# Altium project SBC_Project.PrjPcb (part 2 of 3)

## Sheet 06_DRAM.SchDoc
size A3; SheetNumber: 9; SheetTotal: 21
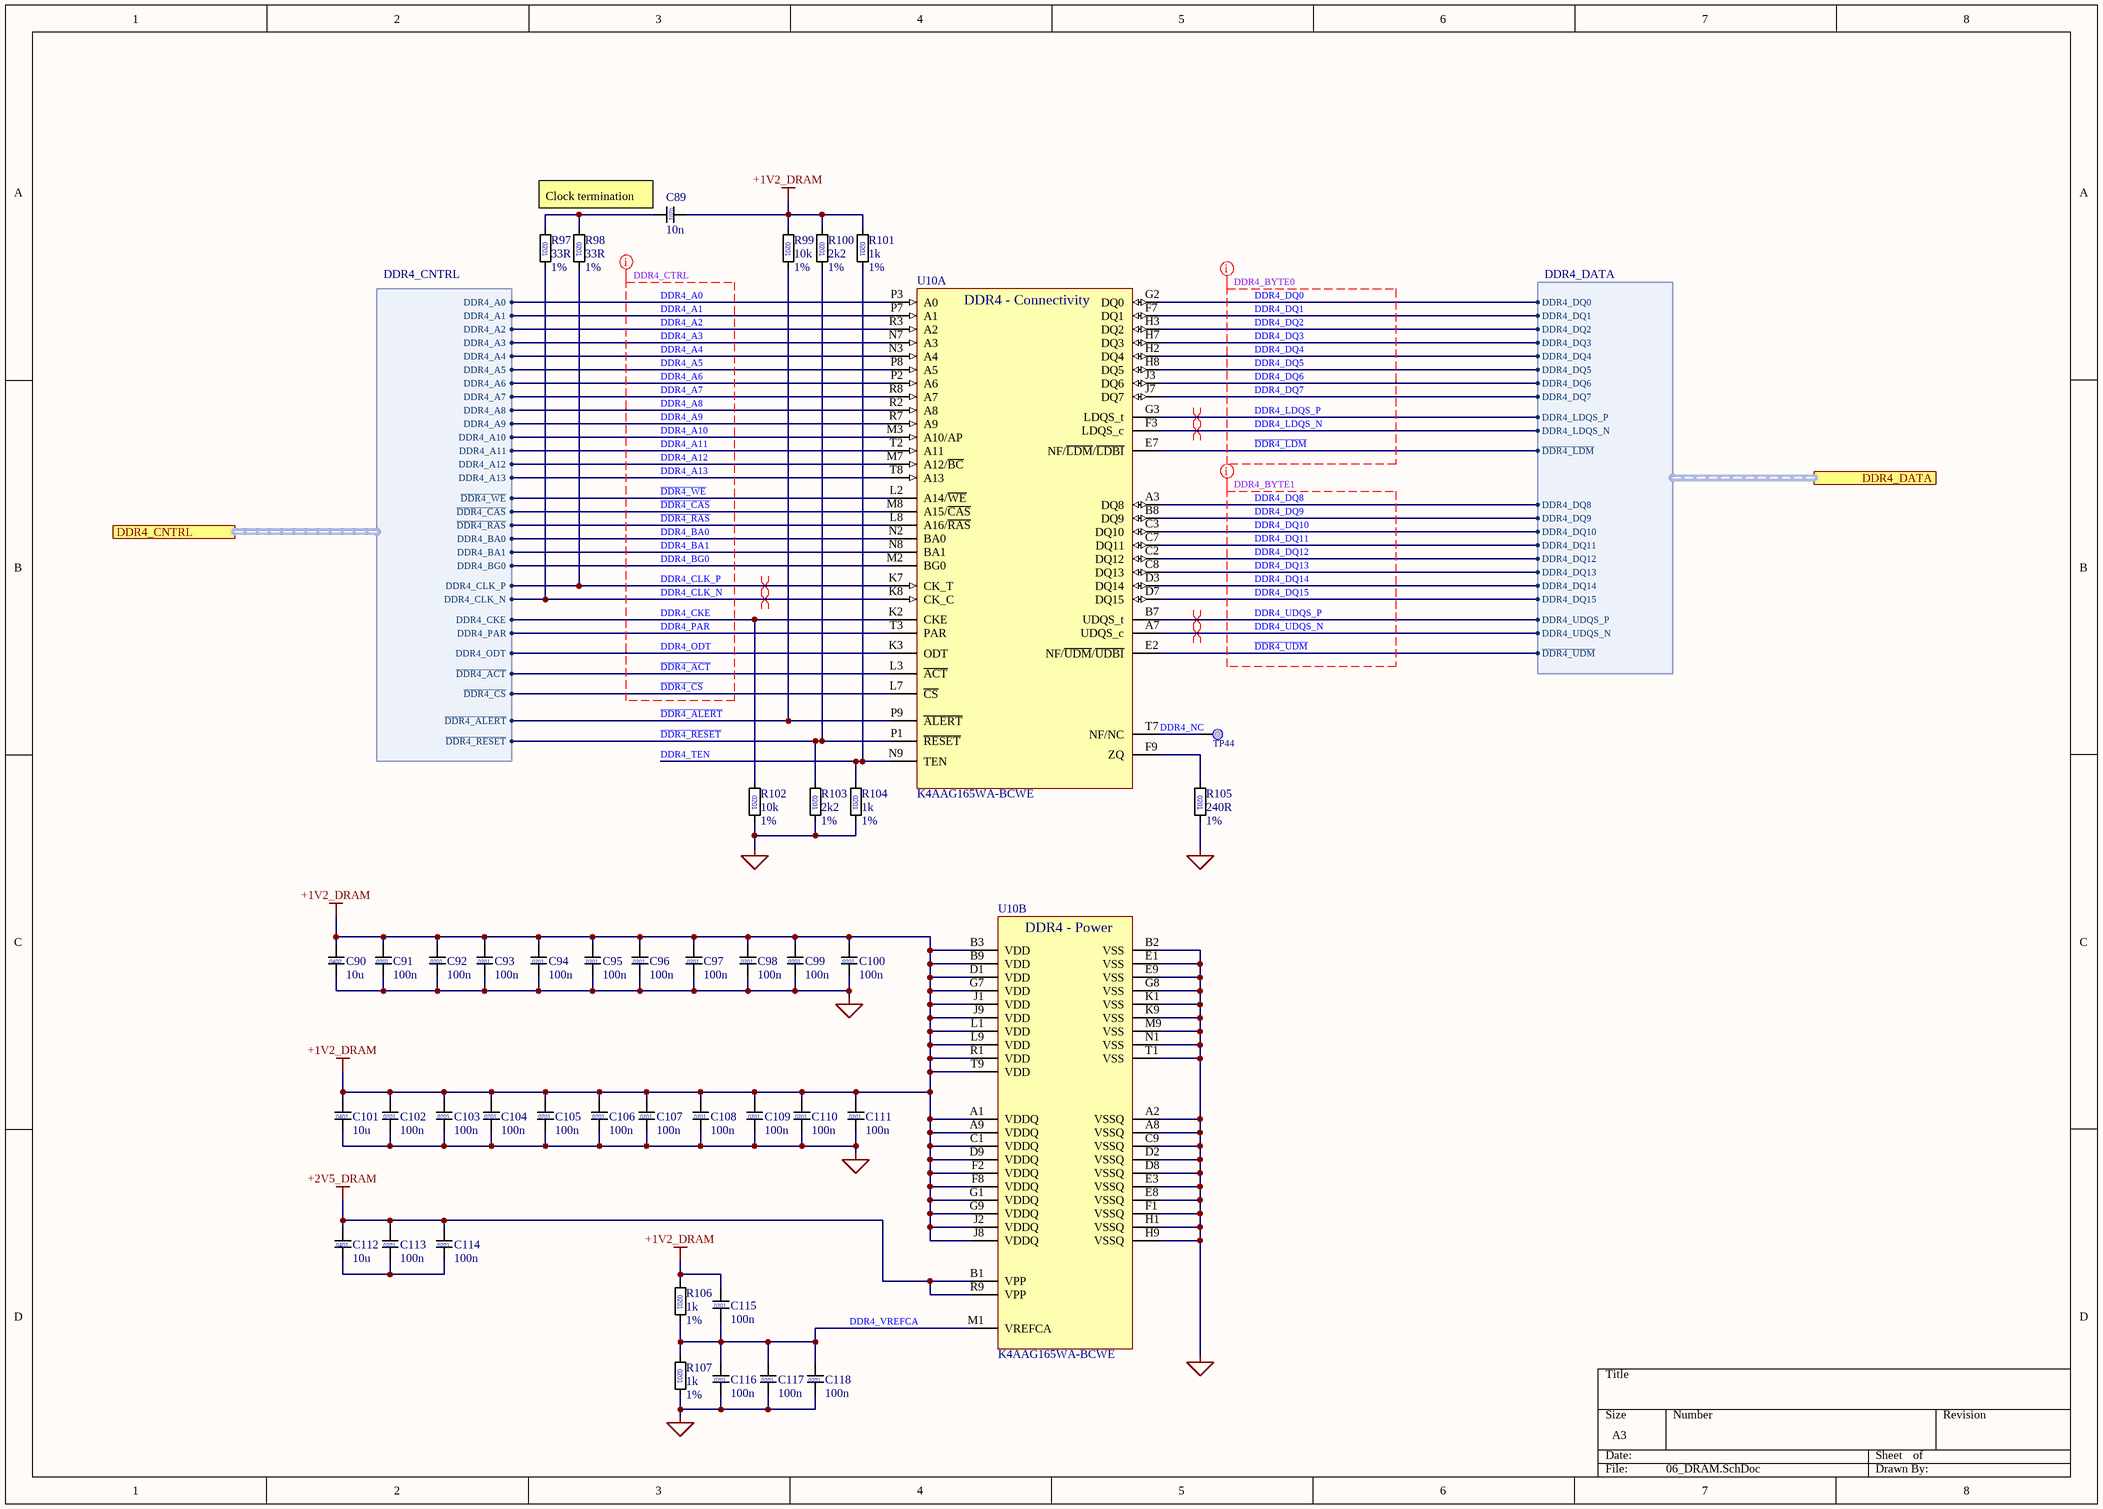
[diagram p8: 06_DRAM.SchDoc]

### Parts
C89  value 10n  [C0201]  (hidden comment: C_0201)
C90  value 10u  [C0402]  (hidden comment: 4u7)
C91  value 100n  [C0201]  (hidden comment: C_0201)
C92  value 100n  [C0201]  (hidden comment: C_0201)
C93  value 100n  [C0201]  (hidden comment: C_0201)
C94  value 100n  [C0201]  (hidden comment: C_0201)
C95  value 100n  [C0201]  (hidden comment: C_0201)
C96  value 100n  [C0201]  (hidden comment: C_0201)
C97  value 100n  [C0201]  (hidden comment: C_0201)
C98  value 100n  [C0201]  (hidden comment: C_0201)
C99  value 100n  [C0201]  (hidden comment: C_0201)
C100  value 100n  [C0201]  (hidden comment: C_0201)
C101  value 10u  [C0402]  (hidden comment: 4u7)
C102  value 100n  [C0201]  (hidden comment: C_0201)
C103  value 100n  [C0201]  (hidden comment: C_0201)
C104  value 100n  [C0201]  (hidden comment: C_0201)
C105  value 100n  [C0201]  (hidden comment: C_0201)
C106  value 100n  [C0201]  (hidden comment: C_0201)
C107  value 100n  [C0201]  (hidden comment: C_0201)
C108  value 100n  [C0201]  (hidden comment: C_0201)
C109  value 100n  [C0201]  (hidden comment: C_0201)
C110  value 100n  [C0201]  (hidden comment: C_0201)
C111  value 100n  [C0201]  (hidden comment: C_0201)
C112  value 10u  [C0402]  (hidden comment: 4u7)
C113  value 100n  [C0201]  (hidden comment: C_0201)
C114  value 100n  [C0201]  (hidden comment: C_0201)
C115  value 100n  [C0201]  (hidden comment: C_0201)
C116  value 100n  [C0201]  (hidden comment: C_0201)
C117  value 100n  [C0201]  (hidden comment: C_0201)
C118  value 100n  [C0201]  (hidden comment: C_0201)
R97  value 33R  Tolerance: 1%  [R0201]  (hidden comment: 0201)
R98  value 33R  Tolerance: 1%  [R0201]  (hidden comment: 0201)
R99  value 10k  Tolerance: 1%  [R0201]  (hidden comment: 0201)
R100  value 2k2  Tolerance: 1%  [R0201]  (hidden comment: 0201)
R101  value 1k  Tolerance: 1%  [R0201]  (hidden comment: 0201)
R102  value 10k  Tolerance: 1%  [R0201]  (hidden comment: 0201)
R103  value 2k2  Tolerance: 1%  [R0201]  (hidden comment: 0201)
R104  value 1k  Tolerance: 1%  [R0201]  (hidden comment: 0201)
R105  value 240R  Tolerance: 1%  [R0201]  (hidden comment: 0201)
R106  value 1k  Tolerance: 1%  [R0201]  (hidden comment: 0201)
R107  value 1k  Tolerance: 1%  [R0201]  (hidden comment: 0201)
TP44  Testpoint 0.5mm  [TP_0.50mm]  (value not drawn)  (no BOM)
U10  K4AAG165WA-BCWE  [FBGA-96_8x14mm_Layout9x16_P0.8mm]  (parts A,B of 2)

### Ports
DDR4_CNTRL (harness DDR4_CNTRL, see 01_SBC_SCH[3A], 02_SoC_DRAM_DDR4[1B]), DDR4_DATA (harness DDR4_DATA, see 01_SBC_SCH[3A], 02_SoC_DRAM_DDR4[7B])

### Harnesses
DDR4_CNTRL: DDR4_A0, DDR4_A1, DDR4_A2, DDR4_A3, DDR4_A4, DDR4_A5, DDR4_A6, DDR4_A7, DDR4_A8, DDR4_A9, DDR4_A10, DDR4_A11, DDR4_A12, DDR4_A13, ~{DDR4_WE}, ~{DDR4_CAS}, ~{DDR4_RAS}, DDR4_BA0, DDR4_BA1, DDR4_BG0, DDR4_CLK_P, DDR4_CLK_N, DDR4_CKE, DDR4_PAR, DDR4_ODT, ~{DDR4_ACT}, ~{DDR4_CS}, ~{DDR4_ALERT}, ~{DDR4_RESET}
DDR4_DATA: DDR4_DQ0, DDR4_DQ1, DDR4_DQ2, DDR4_DQ3, DDR4_DQ4, DDR4_DQ5, DDR4_DQ6, DDR4_DQ7, DDR4_LDQS_P, DDR4_LDQS_N, ~{DDR4_LDM}, DDR4_DQ8, DDR4_DQ9, DDR4_DQ10, DDR4_DQ11, DDR4_DQ12, DDR4_DQ13, DDR4_DQ14, DDR4_DQ15, DDR4_UDQS_P, DDR4_UDQS_N, ~{DDR4_UDM}

### Nets
+1V2_DRAM: C89.2 C90.1 C91.1 C92.1 C93.1 C94.1 C95.1 C96.1 C97.1 C98.1 C99.1 C100.1 C101.1 C102.1 C103.1 C104.1 C105.1 C106.1 C107.1 C108.1 C109.1 C110.1 C111.1 C115.1 R99.1 R100.1 R101.1 R106.1 U10.A1(VDDQ) U10.A9(VDDQ) U10.B3(VDD) U10.B9(VDD) U10.C1(VDDQ) U10.D1(VDD) U10.D9(VDDQ) U10.F2(VDDQ) U10.F8(VDDQ) U10.G1(VDDQ) U10.G7(VDD) U10.G9(VDDQ) U10.J1(VDD) U10.J2(VDDQ) U10.J8(VDDQ) U10.J9(VDD) U10.L1(VDD) U10.L9(VDD) U10.R1(VDD) U10.T9(VDD)
+2V5_DRAM: C112.1 C113.1 C114.1 U10.B1(VPP) U10.R9(VPP)
GND: C90.2 C91.2 C92.2 C93.2 C94.2 C95.2 C96.2 C97.2 C98.2 C99.2 C100.2 C101.2 C102.2 C103.2 C104.2 C105.2 C106.2 C107.2 C108.2 C109.2 C110.2 C111.2 C116.2 C117.2 C118.2 R102.2 R103.2 R104.2 R105.2 R107.2 U10.A2(VSSQ) U10.A8(VSSQ) U10.B2(VSS) U10.C9(VSSQ) U10.D2(VSSQ) U10.D8(VSSQ) U10.E1(VSS) U10.E3(VSSQ) U10.E8(VSSQ) U10.E9(VSS) U10.F1(VSSQ) U10.G8(VSS) U10.H1(VSSQ) U10.H9(VSSQ) U10.K1(VSS) U10.K9(VSS) U10.M9(VSS) U10.N1(VSS) U10.T1(VSS)
~{DDR4_ACT}: U10.L3(~{ACT}) ; port DDR4_CNTRL.~{DDR4_ACT}
~{DDR4_ALERT}: R99.2 U10.P9(~{ALERT}) ; port DDR4_CNTRL.~{DDR4_ALERT}
~{DDR4_CAS}: U10.M8(A15/~{CAS}) ; port DDR4_CNTRL.~{DDR4_CAS}
~{DDR4_CS}: U10.L7(~{CS}) ; port DDR4_CNTRL.~{DDR4_CS}
~{DDR4_LDM}: U10.E7(NF/~{LDM}/~{LDBI}) ; port DDR4_DATA.~{DDR4_LDM}
~{DDR4_RAS}: U10.L8(A16/~{RAS}) ; port DDR4_CNTRL.~{DDR4_RAS}
~{DDR4_RESET}: R100.2 R103.1 U10.P1(~{RESET}) ; port DDR4_CNTRL.~{DDR4_RESET}
~{DDR4_UDM}: U10.E2(NF/~{UDM}/~{UDBI}) ; port DDR4_DATA.~{DDR4_UDM}
~{DDR4_WE}: U10.L2(A14/~{WE}) ; port DDR4_CNTRL.~{DDR4_WE}
DDR4_A0: U10.P3(A0) ; port DDR4_CNTRL.DDR4_A0
DDR4_A1: U10.P7(A1) ; port DDR4_CNTRL.DDR4_A1
DDR4_A2: U10.R3(A2) ; port DDR4_CNTRL.DDR4_A2
DDR4_A3: U10.N7(A3) ; port DDR4_CNTRL.DDR4_A3
DDR4_A4: U10.N3(A4) ; port DDR4_CNTRL.DDR4_A4
DDR4_A5: U10.P8(A5) ; port DDR4_CNTRL.DDR4_A5
DDR4_A6: U10.P2(A6) ; port DDR4_CNTRL.DDR4_A6
DDR4_A7: U10.R8(A7) ; port DDR4_CNTRL.DDR4_A7
DDR4_A8: U10.R2(A8) ; port DDR4_CNTRL.DDR4_A8
DDR4_A9: U10.R7(A9) ; port DDR4_CNTRL.DDR4_A9
DDR4_A10: U10.M3(A10/AP) ; port DDR4_CNTRL.DDR4_A10
DDR4_A11: U10.T2(A11) ; port DDR4_CNTRL.DDR4_A11
DDR4_A12: U10.M7(A12/~{BC}) ; port DDR4_CNTRL.DDR4_A12
DDR4_A13: U10.T8(A13) ; port DDR4_CNTRL.DDR4_A13
DDR4_BA0: U10.N2(BA0) ; port DDR4_CNTRL.DDR4_BA0
DDR4_BA1: U10.N8(BA1) ; port DDR4_CNTRL.DDR4_BA1
DDR4_BG0: U10.M2(BG0) ; port DDR4_CNTRL.DDR4_BG0
DDR4_CKE: R102.1 U10.K2(CKE) ; port DDR4_CNTRL.DDR4_CKE
DDR4_CLK_N: R97.2 U10.K8(CK_C) ; port DDR4_CNTRL.DDR4_CLK_N
DDR4_CLK_P: R98.2 U10.K7(CK_T) ; port DDR4_CNTRL.DDR4_CLK_P
DDR4_DQ0: U10.G2(DQ0) ; port DDR4_DATA.DDR4_DQ0
DDR4_DQ1: U10.F7(DQ1) ; port DDR4_DATA.DDR4_DQ1
DDR4_DQ2: U10.H3(DQ2) ; port DDR4_DATA.DDR4_DQ2
DDR4_DQ3: U10.H7(DQ3) ; port DDR4_DATA.DDR4_DQ3
DDR4_DQ4: U10.H2(DQ4) ; port DDR4_DATA.DDR4_DQ4
DDR4_DQ5: U10.H8(DQ5) ; port DDR4_DATA.DDR4_DQ5
DDR4_DQ6: U10.J3(DQ6) ; port DDR4_DATA.DDR4_DQ6
DDR4_DQ7: U10.J7(DQ7) ; port DDR4_DATA.DDR4_DQ7
DDR4_DQ8: U10.A3(DQ8) ; port DDR4_DATA.DDR4_DQ8
DDR4_DQ9: U10.B8(DQ9) ; port DDR4_DATA.DDR4_DQ9
DDR4_DQ10: U10.C3(DQ10) ; port DDR4_DATA.DDR4_DQ10
DDR4_DQ11: U10.C7(DQ11) ; port DDR4_DATA.DDR4_DQ11
DDR4_DQ12: U10.C2(DQ12) ; port DDR4_DATA.DDR4_DQ12
DDR4_DQ13: U10.C8(DQ13) ; port DDR4_DATA.DDR4_DQ13
DDR4_DQ14: U10.D3(DQ14) ; port DDR4_DATA.DDR4_DQ14
DDR4_DQ15: U10.D7(DQ15) ; port DDR4_DATA.DDR4_DQ15
DDR4_LDQS_N: U10.F3(LDQS_c) ; port DDR4_DATA.DDR4_LDQS_N
DDR4_LDQS_P: U10.G3(LDQS_t) ; port DDR4_DATA.DDR4_LDQS_P
DDR4_NC: TP44.TP U10.T7(NF/NC)
DDR4_ODT: U10.K3(ODT) ; port DDR4_CNTRL.DDR4_ODT
DDR4_PAR: U10.T3(PAR) ; port DDR4_CNTRL.DDR4_PAR
DDR4_TEN: R101.2 R104.1 U10.N9(TEN)
DDR4_UDQS_N: U10.A7(UDQS_c) ; port DDR4_DATA.DDR4_UDQS_N
DDR4_UDQS_P: U10.B7(UDQS_t) ; port DDR4_DATA.DDR4_UDQS_P
DDR4_VREFCA: C115.2 C116.1 C117.1 C118.1 R106.2 R107.1 U10.M1(VREFCA)
NetC89_1: C89.1 R97.1 R98.1
NetC112_2: C112.2 C113.2 C114.2
NetR105_1: R105.1 U10.F9(ZQ)

### Layout directives
net class DDR4_BYTE0; rule Length Constraint [Min Delay = 0ps    Max Delay = 500ps]; rule Matched Net Lengths [Delay Tolerance = 0.4ps]; rule Matched Net Lengths [Delay Tolerance = 2ps]; net class SE45: DDR4_DQ0, DDR4_DQ1, DDR4_DQ2, DDR4_DQ3, DDR4_DQ4, DDR4_DQ5, DDR4_DQ6, DDR4_DQ7, DDR4_LDQS_N, DDR4_LDQS_P, ~{DDR4_LDM}
net class DDR4_BYTE1; rule Length Constraint [Min Delay = 0ps    Max Delay = 500ps]; rule Matched Net Lengths [Delay Tolerance = 0.4ps]; rule Matched Net Lengths [Delay Tolerance = 2ps]; net class SE45: DDR4_DQ8, DDR4_DQ9, DDR4_DQ10, DDR4_DQ11, DDR4_DQ12, DDR4_DQ13, DDR4_DQ14, DDR4_DQ15, DDR4_UDQS_N, DDR4_UDQS_P, ~{DDR4_UDM}
differential pair; differential pair class DIFF85: DDR4_CLK_N, DDR4_CLK_P, DDR4_LDQS_N, DDR4_LDQS_P, DDR4_UDQS_N, DDR4_UDQS_P
net class DDR4_CTRL; rule Matched Net Lengths [Delay Tolerance = 3ps]; rule Length Constraint [Min Delay = 0ps    Max Delay = 500ps]; net class SE45; rule Matched Net Lengths [Delay Tolerance = 0.4ps]: DDR4_A0, DDR4_A1, DDR4_A2, DDR4_A3, DDR4_A4, DDR4_A5, DDR4_A6, DDR4_A7, DDR4_A8, DDR4_A9, DDR4_A10, DDR4_A11, DDR4_A12, DDR4_A13, DDR4_BA0, DDR4_BA1, DDR4_BG0, DDR4_CKE, DDR4_CLK_N, DDR4_CLK_P, DDR4_ODT, DDR4_PAR, ~{DDR4_ACT}, ~{DDR4_CAS}, ~{DDR4_CS}, ~{DDR4_RAS}, ~{DDR4_WE}

### Notes on the sheet
- (near C89) Clock termination
- (in symbol C_0201) 0201
- (in symbol C_0402) 0402
- (in symbol K4AAG165WA-BCWE, part A) DDR4 - Connectivity
- (in symbol K4AAG165WA-BCWE, part B) DDR4 - Power

### Library data of the parts
C89 C91-C100 C102-C111 C113-C118 = C_0201: MLCC 0201; Manufacturer_Name: *; Manufacturer_Part_Number: *
C90 C101 C112 = C_0402: MLCC 0402; Manufacturer_Name: *; Manufacturer_Part_Number: *
R97-R107 = R_0201: Manufacturer_Name: *; Manufacturer_Part_Number: *
U10 = K4AAG165WA-BCWE: 1G x 16-bit (16 Gbit) CMOS Double Data Rate IV Synchronous RAM, FBGA-96; KiCad_Footprint: Package_BGA:Samsung_FBGA-96_8x14mm_Layout9x16_P0.8mm; Datasheet: https://www.alldatasheet.com/datasheet-pdf/pdf/1643784/SAMSUNG/K4AAG165WA-BCWE.html; ComponentLink1Description: Datasheet; ComponentLink1URL: https://www.alldatasheet.com/datasheet-pdf/pdf/1643784/SAMSUNG/K4AAG165WA-BCWE.html; Manufacturer_Name: *; Manufacturer_Part_Number: *

## Sheet 13_eMMC_Flash.SchDoc
size A3; SheetNumber: 10; SheetTotal: 21
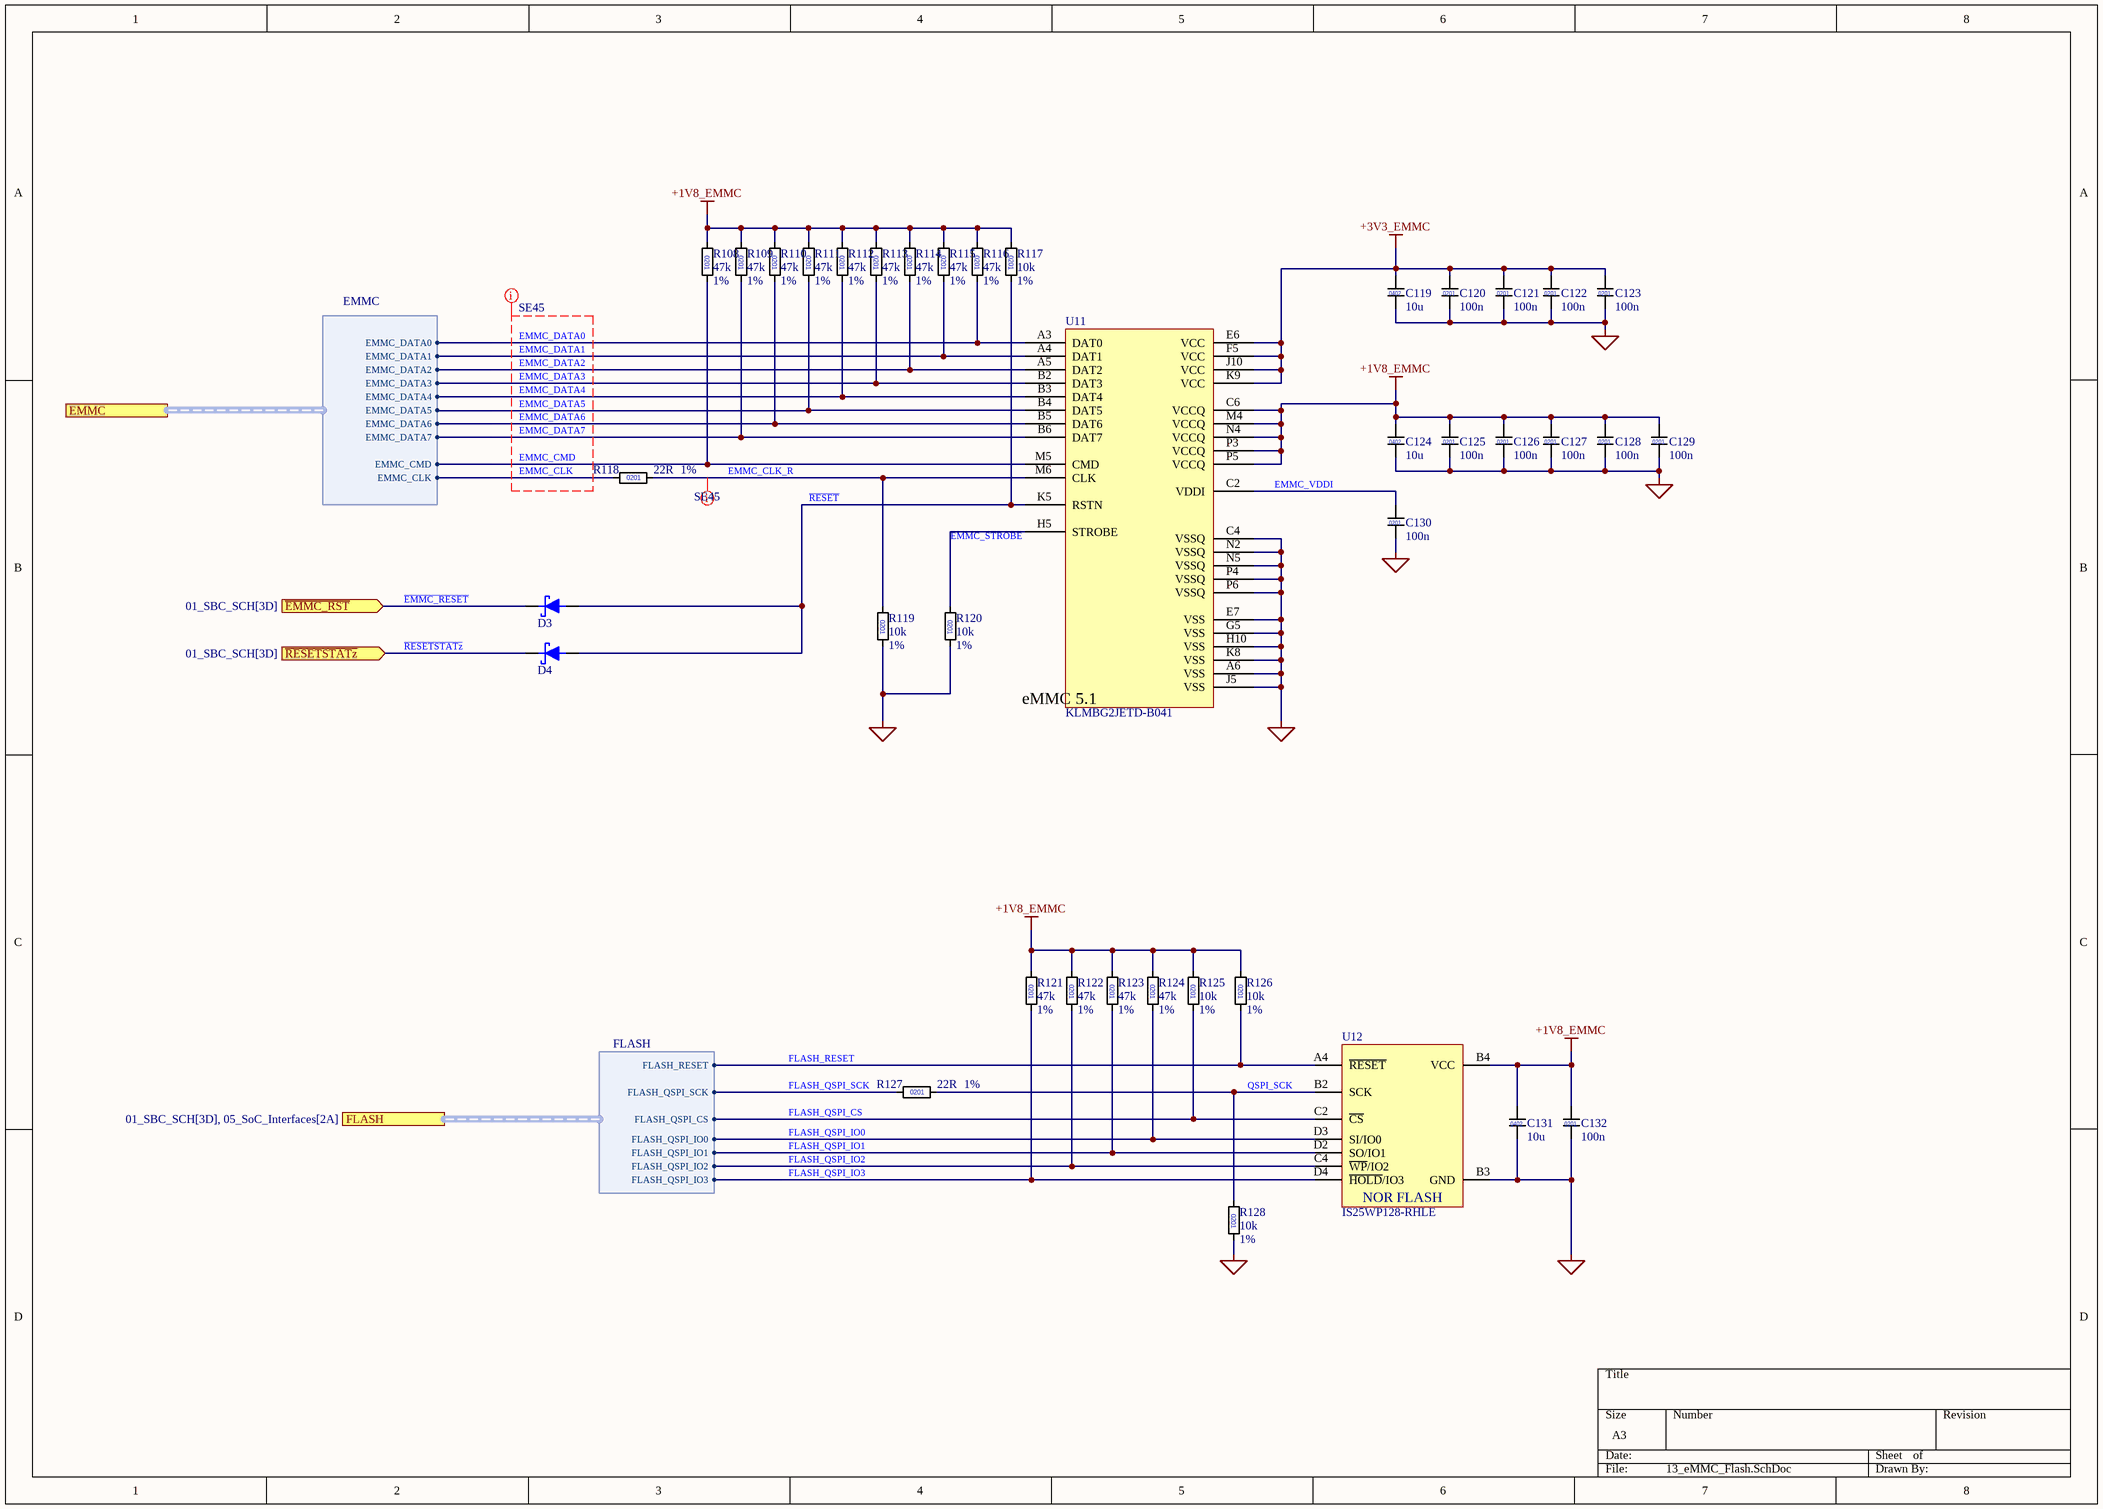
[diagram p9: 13_eMMC_Flash.SchDoc]

### Parts
C119  value 10u  [C0402]  (hidden comment: 4u7)
C120  value 100n  [C0201]  (hidden comment: C_0201)
C121  value 100n  [C0201]  (hidden comment: C_0201)
C122  value 100n  [C0201]  (hidden comment: C_0201)
C123  value 100n  [C0201]  (hidden comment: C_0201)
C124  value 10u  [C0402]  (hidden comment: 4u7)
C125  value 100n  [C0201]  (hidden comment: C_0201)
C126  value 100n  [C0201]  (hidden comment: C_0201)
C127  value 100n  [C0201]  (hidden comment: C_0201)
C128  value 100n  [C0201]  (hidden comment: C_0201)
C129  value 100n  [C0201]  (hidden comment: C_0201)
C130  value 100n  [C0201]  (hidden comment: C_0201)
C131  value 10u  [C0402]  (hidden comment: 4u7)
C132  value 100n  [C0201]  (hidden comment: C_0201)
D3  D_Filled  [D_SOD-523]  (value not drawn)
D4  D_Filled  [D_SOD-523]  (value not drawn)
R108  value 47k  Tolerance: 1%  [R0201]  (hidden comment: 0201)
R109  value 47k  Tolerance: 1%  [R0201]  (hidden comment: 0201)
R110  value 47k  Tolerance: 1%  [R0201]  (hidden comment: 0201)
R111  value 47k  Tolerance: 1%  [R0201]  (hidden comment: 0201)
R112  value 47k  Tolerance: 1%  [R0201]  (hidden comment: 0201)
R113  value 47k  Tolerance: 1%  [R0201]  (hidden comment: 0201)
R114  value 47k  Tolerance: 1%  [R0201]  (hidden comment: 0201)
R115  value 47k  Tolerance: 1%  [R0201]  (hidden comment: 0201)
R116  value 47k  Tolerance: 1%  [R0201]  (hidden comment: 0201)
R117  value 10k  Tolerance: 1%  [R0201]  (hidden comment: 0201)
R118  value 22R  Tolerance: 1%  [R0201]  (hidden comment: 0201)
R119  value 10k  Tolerance: 1%  [R0201]  (hidden comment: 0201)
R120  value 10k  Tolerance: 1%  [R0201]  (hidden comment: 0201)
R121  value 47k  Tolerance: 1%  [R0201]  (hidden comment: 0201)
R122  value 47k  Tolerance: 1%  [R0201]  (hidden comment: 0201)
R123  value 47k  Tolerance: 1%  [R0201]  (hidden comment: 0201)
R124  value 47k  Tolerance: 1%  [R0201]  (hidden comment: 0201)
R125  value 10k  Tolerance: 1%  [R0201]  (hidden comment: 0201)
R126  value 10k  Tolerance: 1%  [R0201]  (hidden comment: 0201)
R127  value 22R  Tolerance: 1%  [R0201]  (hidden comment: 0201)
R128  value 10k  Tolerance: 1%  [R0201]  (hidden comment: 0201)
U11  KLMBG2JETD-B041  [LFBGA-153_11.5x13mm_Layout14x14_P0.5mm]
U12  IS25WP128-RHLE  [IS25WP128-RHLE]

### Ports
EMMC (harness EMMC, see 01_SBC_SCH[3C], 05_SoC_Interfaces[7A]), FLASH (harness FLASH, see 01_SBC_SCH[3D], 05_SoC_Interfaces[2A]), ~{EMMC_RST} (in, see 01_SBC_SCH[3D]), ~{RESETSTATz} (in, see 01_SBC_SCH[3D])

### Harnesses
EMMC: EMMC_DATA0, EMMC_DATA1, EMMC_DATA2, EMMC_DATA3, EMMC_DATA4, EMMC_DATA5, EMMC_DATA6, EMMC_DATA7, EMMC_CMD, EMMC_CLK
FLASH: FLASH_QSPI_SCK, FLASH_QSPI_CS, FLASH_QSPI_IO0, FLASH_QSPI_IO1, FLASH_QSPI_IO2, FLASH_QSPI_IO3, FLASH_RESET

### Nets
+1V8_EMMC: C124.1 C125.1 C126.1 C127.1 C128.1 C129.1 C131.1 C132.1 R108.1 R109.1 R110.1 R111.1 R112.1 R113.1 R114.1 R115.1 R116.1 R117.1 R121.1 R122.1 R123.1 R124.1 R125.1 R126.1 U11.C6(VCCQ) U11.M4(VCCQ) U11.N4(VCCQ) U11.P3(VCCQ) U11.P5(VCCQ) U12.B4(VCC)
+3V3_EMMC: C119.1 C120.1 C121.1 C122.1 C123.1 U11.E6(VCC) U11.F5(VCC) U11.J10(VCC) U11.K9(VCC)
GND: C119.2 C120.2 C121.2 C122.2 C123.2 C124.2 C125.2 C126.2 C127.2 C128.2 C129.2 C130.2 C131.2 C132.2 R119.2 R120.2 R128.2 U11.A6(VSS) U11.C4(VSSQ) U11.E7(VSS) U11.G5(VSS) U11.H10(VSS) U11.J5(VSS) U11.K8(VSS) U11.N2(VSSQ) U11.N5(VSSQ) U11.P4(VSSQ) U11.P6(VSSQ) U12.B3(GND)
~{EMMC_RESET}: D3.1(K) ; port ~{EMMC_RST}
~{RESET}: D3.2(A) D4.2(A) R117.2 U11.K5(RSTN)
~{RESETSTATz}: D4.1(K) ; port ~{RESETSTATz}
EMMC_CLK: R118.1 ; port EMMC.EMMC_CLK
EMMC_CLK_R: R118.2 R119.1 U11.M6(CLK)
EMMC_CMD: R108.2 U11.M5(CMD) ; port EMMC.EMMC_CMD
EMMC_DATA0: R116.2 U11.A3(DAT0) ; port EMMC.EMMC_DATA0
EMMC_DATA1: R115.2 U11.A4(DAT1) ; port EMMC.EMMC_DATA1
EMMC_DATA2: R114.2 U11.A5(DAT2) ; port EMMC.EMMC_DATA2
EMMC_DATA3: R113.2 U11.B2(DAT3) ; port EMMC.EMMC_DATA3
EMMC_DATA4: R112.2 U11.B3(DAT4) ; port EMMC.EMMC_DATA4
EMMC_DATA5: R111.2 U11.B4(DAT5) ; port EMMC.EMMC_DATA5
EMMC_DATA6: R110.2 U11.B5(DAT6) ; port EMMC.EMMC_DATA6
EMMC_DATA7: R109.2 U11.B6(DAT7) ; port EMMC.EMMC_DATA7
EMMC_STROBE: R120.1 U11.H5(STROBE)
EMMC_VDDI: C130.1 U11.C2(VDDI)
FLASH_QSPI_CS: R125.2 U12.C2(~{CS}) ; port FLASH.FLASH_QSPI_CS
FLASH_QSPI_IO0: R124.2 U12.D3(SI/IO0) ; port FLASH.FLASH_QSPI_IO0
FLASH_QSPI_IO1: R123.2 U12.D2(SO/IO1) ; port FLASH.FLASH_QSPI_IO1
FLASH_QSPI_IO2: R122.2 U12.C4(~{WP}/IO2) ; port FLASH.FLASH_QSPI_IO2
FLASH_QSPI_IO3: R121.2 U12.D4(~{HOLD}/IO3) ; port FLASH.FLASH_QSPI_IO3
FLASH_QSPI_SCK: R127.1 ; port FLASH.FLASH_QSPI_SCK
FLASH_RESET: R126.2 U12.A4(~{RESET}) ; port FLASH.FLASH_RESET
QSPI_SCK: R127.2 R128.1 U12.B2(SCK)

### Layout directives
net class SE45: EMMC_CLK, EMMC_CLK_R, EMMC_CMD, EMMC_DATA0, EMMC_DATA1, EMMC_DATA2, EMMC_DATA3, EMMC_DATA4, EMMC_DATA5, EMMC_DATA6, EMMC_DATA7

### Notes on the sheet
- (in symbol C_0201) 0201
- (in symbol C_0402) 0402
- (in symbol IS25WP128-RHLE) NOR FLASH
- (in symbol KLMBG2JETD-B041) eMMC 5.1

### Library data of the parts
C119 C124 C131 = C_0402: MLCC 0402; Manufacturer_Name: *; Manufacturer_Part_Number: *
C120-C123 C125-C130 C132 = C_0201: MLCC 0201; Manufacturer_Name: *; Manufacturer_Part_Number: *
D3 D4 = D_Filled: Diode, filled shape; Manufacturer_Name: Panjit International Inc.; Value: BAT54TS_R1_00001; Manufacturer Part Number: BAT54TS_R1_00001
R108-R128 = R_0201: Manufacturer_Name: *; Manufacturer_Part_Number: *
U11 = KLMBG2JETD-B041: Samsung eMMC 5.1, 32GB, NAND flash + MMC controller, HS400 capable, FBGA-153; KiCad_Footprint: Package_BGA:Samsung_FBGA-153_11.5x13mm_Layout14x14_P0.5mm; Datasheet: https://www.lcsc.com/datasheet/C2803245.pdf; ComponentLink1Description: Datasheet; ComponentLink1URL: https://www.lcsc.com/datasheet/C2803245.pdf; Manufacturer_Name: *; Manufacturer_Part_Number: *
U12 = IS25WP128-RHLE: 128Mbit 1.65V~1.95V 133MHz SPI TFBGA-24(6x8) Memory RoHS; Manufacturer_Name: *; Manufacturer_Part_Number: *; Value: IS25WP128-RHLE

## Sheet 08_Voltage_Translator.SchDoc
size A3; SheetNumber: 11; SheetTotal: 21
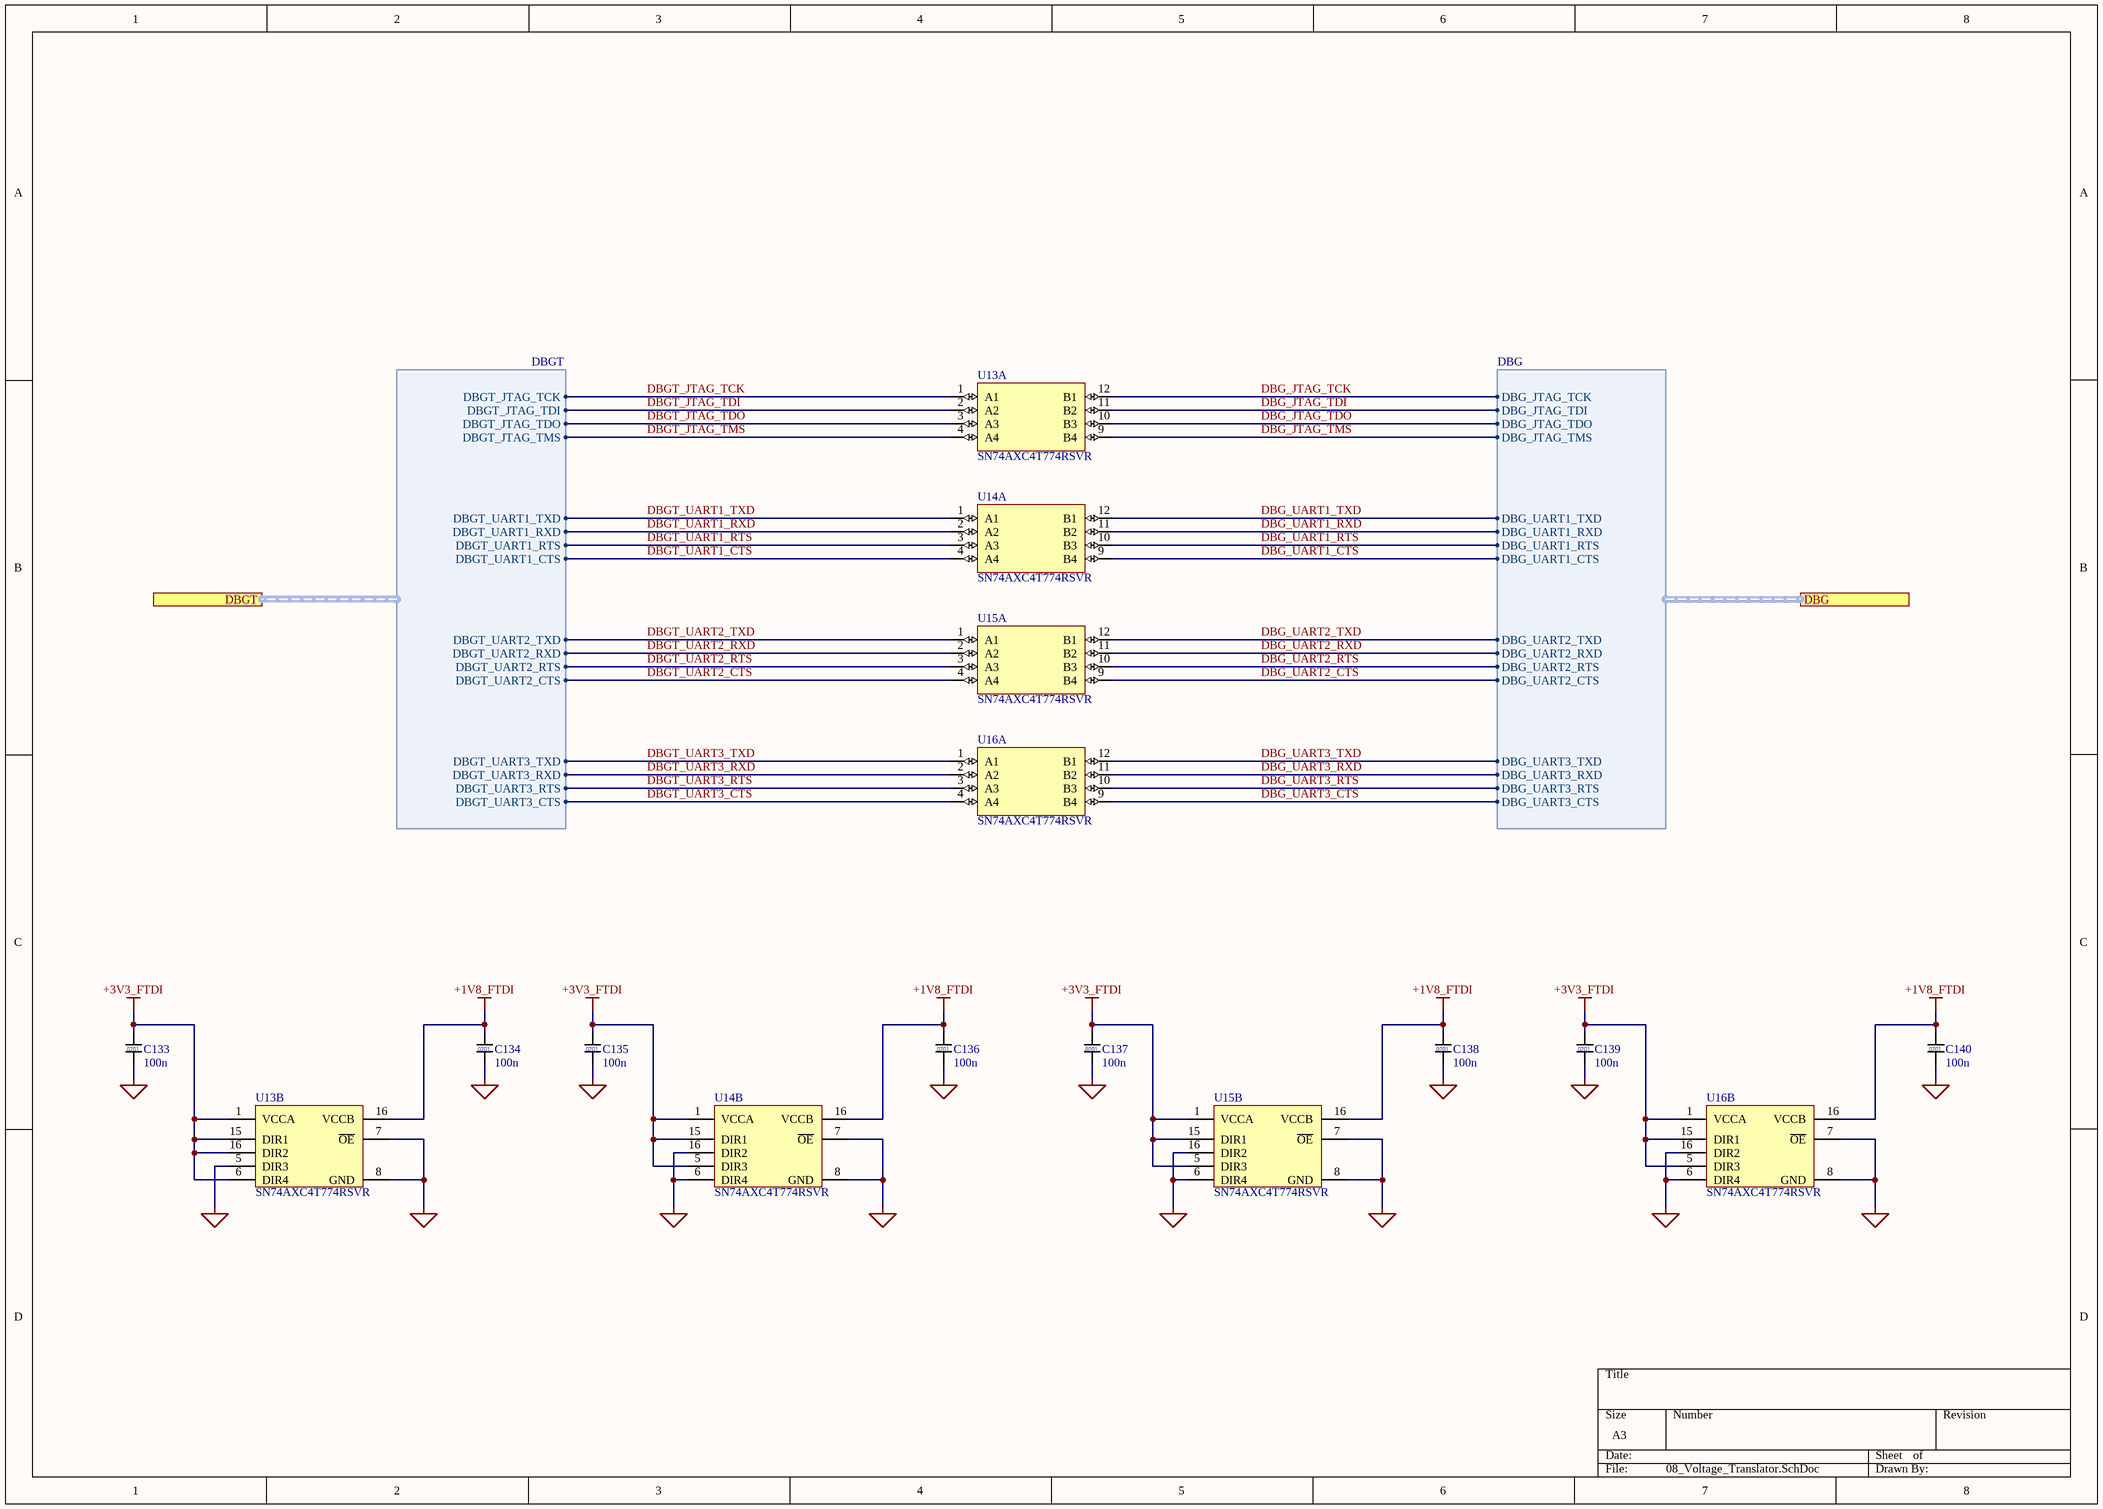
[diagram p10: 08_Voltage_Translator.SchDoc]

### Parts
C133  value 100n  [C0201]  (hidden comment: C_0201)
C134  value 100n  [C0201]  (hidden comment: C_0201)
C135  value 100n  [C0201]  (hidden comment: C_0201)
C136  value 100n  [C0201]  (hidden comment: C_0201)
C137  value 100n  [C0201]  (hidden comment: C_0201)
C138  value 100n  [C0201]  (hidden comment: C_0201)
C139  value 100n  [C0201]  (hidden comment: C_0201)
C140  value 100n  [C0201]  (hidden comment: C_0201)
U13  SN74AXC4T774RSVR  [UQFN-16_1.8x2.6mm_P0.4mm]  (parts A,B of 2)
U14  SN74AXC4T774RSVR  [UQFN-16_1.8x2.6mm_P0.4mm]  (parts A,B of 2)
U15  SN74AXC4T774RSVR  [UQFN-16_1.8x2.6mm_P0.4mm]  (parts A,B of 2)
U16  SN74AXC4T774RSVR  [UQFN-16_1.8x2.6mm_P0.4mm]  (parts A,B of 2)

### Ports
DBG (harness DBG, see SBC_SCH[3D]), DBGT (harness DBGT, see SBC_SCH[3D], FTDI_USB[8B])

### Harnesses
DBGT: DBGT_JTAG_TCK, DBGT_JTAG_TDI, DBGT_JTAG_TDO, DBGT_JTAG_TMS, DBGT_UART1_TXD, DBGT_UART1_RXD, DBGT_UART1_RTS, DBGT_UART1_CTS, DBGT_UART2_TXD, DBGT_UART2_RXD, DBGT_UART2_RTS, DBGT_UART2_CTS, DBGT_UART3_TXD, DBGT_UART3_RXD, DBGT_UART3_RTS, DBGT_UART3_CTS
DBG: DBG_JTAG_TCK, DBG_JTAG_TDI, DBG_JTAG_TDO, DBG_JTAG_TMS, DBG_UART1_TXD, DBG_UART1_RXD, DBG_UART1_RTS, DBG_UART1_CTS, DBG_UART2_TXD, DBG_UART2_RXD, DBG_UART2_RTS, DBG_UART2_CTS, DBG_UART3_TXD, DBG_UART3_RXD, DBG_UART3_RTS, DBG_UART3_CTS

### Nets
+1V8_FTDI: C134.1 C136.1 C138.1 C140.1 U13.16(VCCB) U14.16(VCCB) U15.16(VCCB) U16.16(VCCB)
+3V3_FTDI: C133.1 C135.1 C137.1 C139.1 U13.1(VCCA) U13.6(DIR4) U13.15(DIR1) U13.16(DIR2) U14.1(VCCA) U14.5(DIR3) U14.15(DIR1) U15.1(VCCA) U15.5(DIR3) U15.15(DIR1) U16.1(VCCA) U16.5(DIR3) U16.15(DIR1)
GND: C133.2 C134.2 C135.2 C136.2 C137.2 C138.2 C139.2 C140.2 U13.5(DIR3) U13.7(~{OE}) U13.8(GND) U14.6(DIR4) U14.7(~{OE}) U14.8(GND) U14.16(DIR2) U15.6(DIR4) U15.7(~{OE}) U15.8(GND) U15.16(DIR2) U16.6(DIR4) U16.7(~{OE}) U16.8(GND) U16.16(DIR2)
DBG_JTAG_TCK: U13.12(B1) ; port DBG.DBG_JTAG_TCK
DBG_JTAG_TDI: U13.11(B2) ; port DBG.DBG_JTAG_TDI
DBG_JTAG_TDO: U13.10(B3) ; port DBG.DBG_JTAG_TDO
DBG_JTAG_TMS: U13.9(B4) ; port DBG.DBG_JTAG_TMS
DBG_UART1_CTS: U14.9(B4) ; port DBG.DBG_UART1_CTS
DBG_UART1_RTS: U14.10(B3) ; port DBG.DBG_UART1_RTS
DBG_UART1_RXD: U14.11(B2) ; port DBG.DBG_UART1_RXD
DBG_UART1_TXD: U14.12(B1) ; port DBG.DBG_UART1_TXD
DBG_UART2_CTS: U15.9(B4) ; port DBG.DBG_UART2_CTS
DBG_UART2_RTS: U15.10(B3) ; port DBG.DBG_UART2_RTS
DBG_UART2_RXD: U15.11(B2) ; port DBG.DBG_UART2_RXD
DBG_UART2_TXD: U15.12(B1) ; port DBG.DBG_UART2_TXD
DBG_UART3_CTS: U16.9(B4) ; port DBG.DBG_UART3_CTS
DBG_UART3_RTS: U16.10(B3) ; port DBG.DBG_UART3_RTS
DBG_UART3_RXD: U16.11(B2) ; port DBG.DBG_UART3_RXD
DBG_UART3_TXD: U16.12(B1) ; port DBG.DBG_UART3_TXD
DBGT_JTAG_TCK: U13.1(A1) ; port DBGT.DBGT_JTAG_TCK
DBGT_JTAG_TDI: U13.2(A2) ; port DBGT.DBGT_JTAG_TDI
DBGT_JTAG_TDO: U13.3(A3) ; port DBGT.DBGT_JTAG_TDO
DBGT_JTAG_TMS: U13.4(A4) ; port DBGT.DBGT_JTAG_TMS
DBGT_UART1_CTS: U14.4(A4) ; port DBGT.DBGT_UART1_CTS
DBGT_UART1_RTS: U14.3(A3) ; port DBGT.DBGT_UART1_RTS
DBGT_UART1_RXD: U14.2(A2) ; port DBGT.DBGT_UART1_RXD
DBGT_UART1_TXD: U14.1(A1) ; port DBGT.DBGT_UART1_TXD
DBGT_UART2_CTS: U15.4(A4) ; port DBGT.DBGT_UART2_CTS
DBGT_UART2_RTS: U15.3(A3) ; port DBGT.DBGT_UART2_RTS
DBGT_UART2_RXD: U15.2(A2) ; port DBGT.DBGT_UART2_RXD
DBGT_UART2_TXD: U15.1(A1) ; port DBGT.DBGT_UART2_TXD
DBGT_UART3_CTS: U16.4(A4) ; port DBGT.DBGT_UART3_CTS
DBGT_UART3_RTS: U16.3(A3) ; port DBGT.DBGT_UART3_RTS
DBGT_UART3_RXD: U16.2(A2) ; port DBGT.DBGT_UART3_RXD
DBGT_UART3_TXD: U16.1(A1) ; port DBGT.DBGT_UART3_TXD

### Notes on the sheet
- (in symbol C_0201) 0201

### Library data of the parts
C133-C140 = C_0201: MLCC 0201; Manufacturer_Name: *; Manufacturer_Part_Number: *
U13-U16 = SN74AXC4T774RSVR: 4-Bit Dual-Supply Bus Transceiver With Configurable Voltage Translation and 3-State Outputs, 16-UQFN (2.6x1.8); Manufacturer_Name: Texas Instruments; Datasheet: https://www.ti.com/lit/ds/symlink/sn74axc4t774.pdf?HQS=dis-dk-null-digikeymode-dsf-pf-null-wwe&ts=1791191909639&ref_url=https%253A%252F%252Fwww.ti.com%252Fgeneral%252Fdocs%252Fsuppproductinfo.tsp%253FdistId%253D10%2526gotoUrl%253Dhttps%253A%252F%252Fwww.ti.com%252Flit%252Fgpn%252Fsn74axc4t774; Manufacturer_Part_Number: SN74AXC4T774RSVR; Value: SN74AXC4T774RSVR

## Sheet 20_MicroSD_Connector.SchDoc
size A3; SheetNumber: 12; SheetTotal: 21
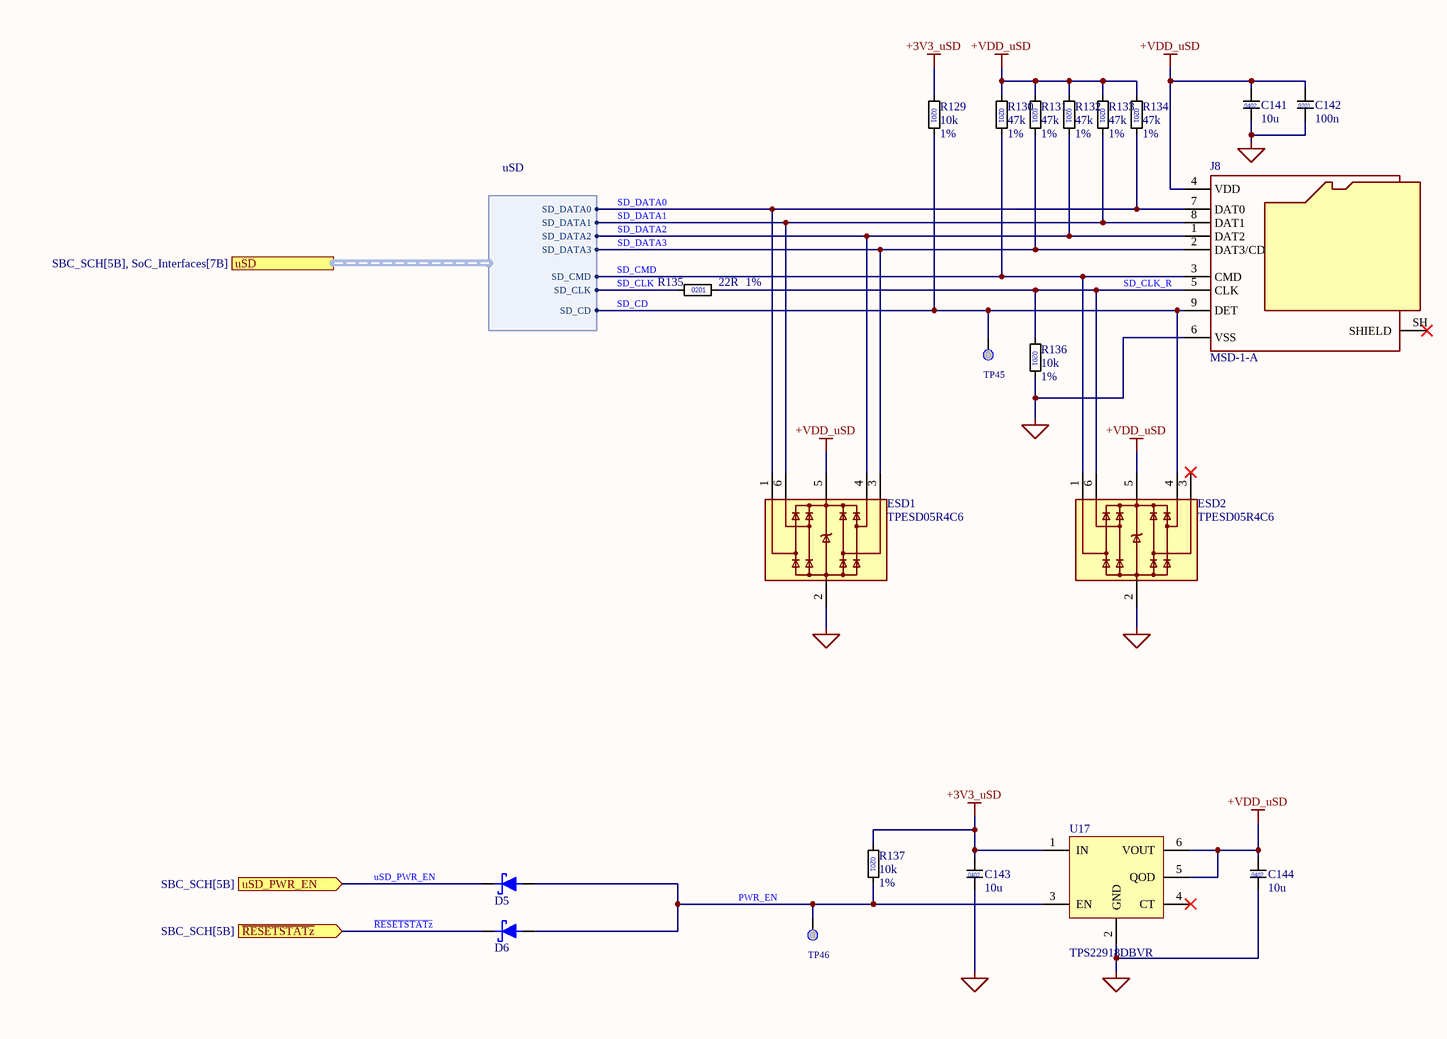
[diagram p11: 20_MicroSD_Connector.SchDoc]

### Parts
C141  value 10u  [C0402]  (hidden comment: 4u7)
C142  value 100n  [C0201]  (hidden comment: C_0201)
C143  value 10u  [C0402]  (hidden comment: 4u7)
C144  value 10u  [C0402]  (hidden comment: 4u7)
D5  D_Filled  [D_SOD-523]  (value not drawn)
D6  D_Filled  [D_SOD-523]  (value not drawn)
ESD1  TPESD05R4C6  [TPESD05R4C6]
ESD2  TPESD05R4C6  [TPESD05R4C6]
J8  MSD-1-A  [MSD-1-A]
R129  value 10k  Tolerance: 1%  [R0201]  (hidden comment: 0201)
R130  value 47k  Tolerance: 1%  [R0201]  (hidden comment: 0201)
R131  value 47k  Tolerance: 1%  [R0201]  (hidden comment: 0201)
R132  value 47k  Tolerance: 1%  [R0201]  (hidden comment: 0201)
R133  value 47k  Tolerance: 1%  [R0201]  (hidden comment: 0201)
R134  value 47k  Tolerance: 1%  [R0201]  (hidden comment: 0201)
R135  value 22R  Tolerance: 1%  [R0201]  (hidden comment: 0201)
R136  value 10k  Tolerance: 1%  [R0201]  (hidden comment: 0201)
R137  value 10k  Tolerance: 1%  [R0201]  (hidden comment: 0201)
TP45  Testpoint 0.5mm  [TP_0.50mm]  (value not drawn)  (no BOM)
TP46  Testpoint 0.5mm  [TP_0.50mm]  (value not drawn)  (no BOM)
U17  value TPS22918DBVR  [SOT-23-6]  (hidden comment: TPS22918)

### Ports
uSD (harness uSD, see SBC_SCH[5B], SoC_Interfaces[7B]), uSD_PWR_EN (in, see SBC_SCH[5B]), ~{RESETSTATz} (in, see SBC_SCH[5B])

### Harnesses
uSD: SD_DATA0, SD_DATA1, SD_DATA2, SD_DATA3, SD_CMD, SD_CLK, SD_CD

### Nets
+3V3_uSD: C143.1 R129.1 R137.1 U17.1(IN)
+VDD_uSD: C141.1 C142.1 C144.1 ESD1.5 ESD2.5 J8.4(VDD) R130.1 R131.1 R132.1 R133.1 R134.1 U17.5(QOD) U17.6(VOUT)
GND: C141.2 C142.2 C143.2 C144.2 ESD1.2 ESD2.2 J8.6(VSS) R136.2 U17.2(GND)
~{RESETSTATz}: D6.1(K) ; port ~{RESETSTATz}
PWR_EN: D5.2(A) D6.2(A) R137.2 TP46.TP U17.3(EN)
SD_CD: ESD2.4 J8.9(DET) R129.2 TP45.TP ; port uSD.SD_CD
SD_CLK: R135.1 ; port uSD.SD_CLK
SD_CLK_R: ESD2.6 J8.5(CLK) R135.2 R136.1
SD_CMD: ESD2.1 J8.3(CMD) R130.2 ; port uSD.SD_CMD
SD_DATA0: ESD1.1 J8.7(DAT0) R134.2 ; port uSD.SD_DATA0
SD_DATA1: ESD1.6 J8.8(DAT1) R133.2 ; port uSD.SD_DATA1
SD_DATA2: ESD1.4 J8.1(DAT2) R132.2 ; port uSD.SD_DATA2
SD_DATA3: ESD1.3 J8.2(DAT3/CD) R131.2 ; port uSD.SD_DATA3
uSD_PWR_EN: D5.1(K) ; port uSD_PWR_EN

Not connected (* = marked no-connect by the designer): ESD2 3*; J8 SH(SHIELD)*; U17 4(CT)*

### Notes on the sheet
- (in symbol C_0201) 0201
- (in symbol C_0402) 0402

### Library data of the parts
C141 C143 C144 = C_0402: MLCC 0402; Manufacturer_Name: *; Manufacturer_Part_Number: *
C142 = C_0201: MLCC 0201; Manufacturer_Name: *; Manufacturer_Part_Number: *
D5 D6 = D_Filled: as D3 on sheet 13_eMMC_Flash; Manufacturer Part Number: BAT54TS_R1_00001
ESD1 ESD2 = TPESD05R4C6: ESD and Surge Protection (TVS/ESD) 1.3pF 5V 5uA 6.5A@8/20us 9V 9V Four channels SOT-363  ROHS; Manufacturer_Name: TECH PUBLIC; Manufacturer_Part_Number: TPESD05R4C6; Value: TPESD05R4C6
J8 = MSD-1-A: Micro SD Card Socket with one card detection pin; Manufacturer_Name: CUI; ComponentLink1Description: Datasheet; ComponentLink1URL: https://datasheet.lcsc.com/lcsc/2110151630_XKB-Connectivity-XKTF-015-N_C381082.pdf; Manufacturer_Part_Number: MSD-1-A; Value: MSD-1-A
R129-R137 = R_0201: Manufacturer_Name: *; Manufacturer_Part_Number: *
U17 = TPS22918: Load Switch -40℃~+105℃ 1 1V~5.5V 2A 53mΩ Active High SOT-23-6 Power Distribution Switches ROHS; Manufacturer_Name: Texas Instruments; Manufacturer_Part_Number: TPS22918DBVR

## Sheet 03_SoC_Power.SchDoc
size A3; SheetNumber: 13; SheetTotal: 21
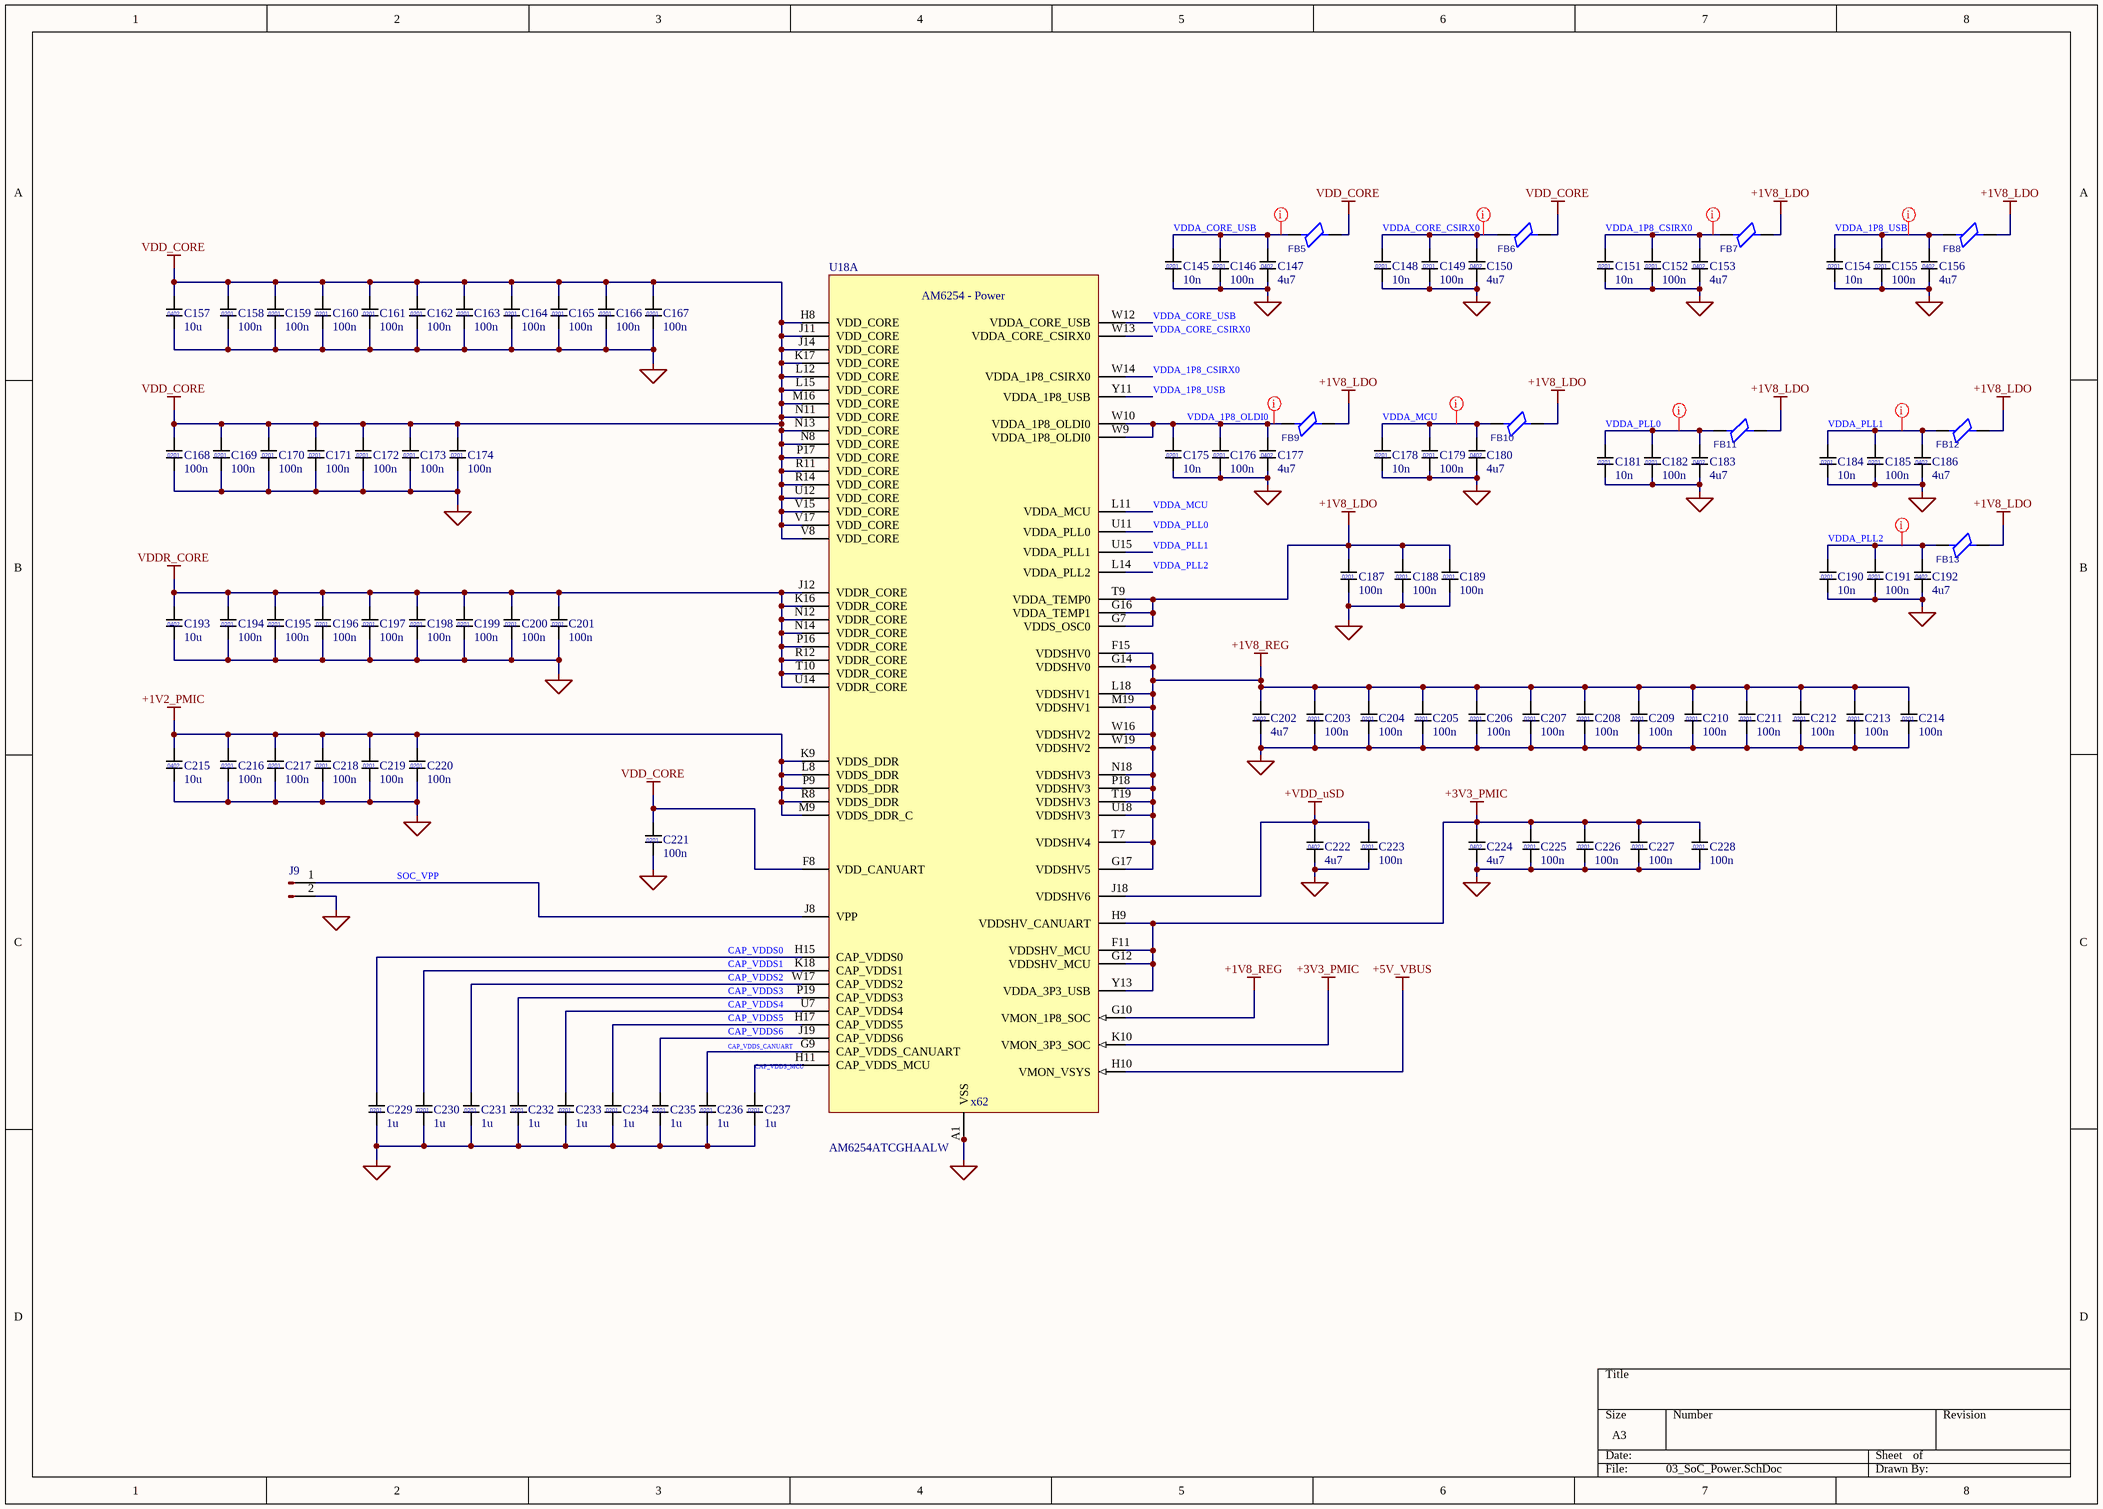
[diagram p12: 03_SoC_Power.SchDoc]

### Parts
(Parts that share a designator on the sheet are numbered #1, #2 ... from top to bottom, then left to right.)
C145  value 10n  [C0201]  (hidden comment: C_0201)
C146  value 100n  [C0201]  (hidden comment: C_0201)
C147  4u7  [C0402]
C148  value 10n  [C0201]  (hidden comment: C_0201)
C149  value 100n  [C0201]  (hidden comment: C_0201)
C150  4u7  [C0402]
C151  value 10n  [C0201]  (hidden comment: C_0201)
C152  value 100n  [C0201]  (hidden comment: C_0201)
C153  4u7  [C0402]
C154  value 10n  [C0201]  (hidden comment: C_0201)
C155  value 100n  [C0201]  (hidden comment: C_0201)
C156  4u7  [C0402]
C157  value 10u  [C0402]  (hidden comment: 4u7)
C158  value 100n  [C0201]  (hidden comment: C_0201)
C159  value 100n  [C0201]  (hidden comment: C_0201)
C160  value 100n  [C0201]  (hidden comment: C_0201)
C161  value 100n  [C0201]  (hidden comment: C_0201)
C162  value 100n  [C0201]  (hidden comment: C_0201)
C163  value 100n  [C0201]  (hidden comment: C_0201)
C164  value 100n  [C0201]  (hidden comment: C_0201)
C165  value 100n  [C0201]  (hidden comment: C_0201)
C166  value 100n  [C0201]  (hidden comment: C_0201)
C167  value 100n  [C0201]  (hidden comment: C_0201)
C168  value 100n  [C0201]  (hidden comment: C_0201)
C169  value 100n  [C0201]  (hidden comment: C_0201)
C170  value 100n  [C0201]  (hidden comment: C_0201)
C171  value 100n  [C0201]  (hidden comment: C_0201)
C172  value 100n  [C0201]  (hidden comment: C_0201)
C173  value 100n  [C0201]  (hidden comment: C_0201)
C174  value 100n  [C0201]  (hidden comment: C_0201)
C175  value 10n  [C0201]  (hidden comment: C_0201)
C176  value 100n  [C0201]  (hidden comment: C_0201)
C177  4u7  [C0402]
C178  value 10n  [C0201]  (hidden comment: C_0201)
C179  value 100n  [C0201]  (hidden comment: C_0201)
C180  4u7  [C0402]
C181  value 10n  [C0201]  (hidden comment: C_0201)
C182  value 100n  [C0201]  (hidden comment: C_0201)
C183  4u7  [C0402]
C184  value 10n  [C0201]  (hidden comment: C_0201)
C185  value 100n  [C0201]  (hidden comment: C_0201)
C186  4u7  [C0402]
C187  value 100n  [C0201]  (hidden comment: C_0201)
C188  value 100n  [C0201]  (hidden comment: C_0201)
C189  value 100n  [C0201]  (hidden comment: C_0201)
C190  value 10n  [C0201]  (hidden comment: C_0201)
C191  value 100n  [C0201]  (hidden comment: C_0201)
C192  4u7  [C0402]
C193  value 10u  [C0402]  (hidden comment: 4u7)
C194  value 100n  [C0201]  (hidden comment: C_0201)
C195  value 100n  [C0201]  (hidden comment: C_0201)
C196  value 100n  [C0201]  (hidden comment: C_0201)
C197  value 100n  [C0201]  (hidden comment: C_0201)
C198  value 100n  [C0201]  (hidden comment: C_0201)
C199  value 100n  [C0201]  (hidden comment: C_0201)
C200  value 100n  [C0201]  (hidden comment: C_0201)
C201  value 100n  [C0201]  (hidden comment: C_0201)
C202  4u7  [C0402]
C203  value 100n  [C0201]  (hidden comment: C_0201)
C204  value 100n  [C0201]  (hidden comment: C_0201)
C205  value 100n  [C0201]  (hidden comment: C_0201)
C206  value 100n  [C0201]  (hidden comment: C_0201)
C207  value 100n  [C0201]  (hidden comment: C_0201)
C208  value 100n  [C0201]  (hidden comment: C_0201)
C209  value 100n  [C0201]  (hidden comment: C_0201)
C210  value 100n  [C0201]  (hidden comment: C_0201)
C211  value 100n  [C0201]  (hidden comment: C_0201)
C212  value 100n  [C0201]  (hidden comment: C_0201)
C213  value 100n  [C0201]  (hidden comment: C_0201)
C214  value 100n  [C0201]  (hidden comment: C_0201)
C215  value 10u  [C0402]  (hidden comment: 4u7)
C216  value 100n  [C0201]  (hidden comment: C_0201)
C217  value 100n  [C0201]  (hidden comment: C_0201)
C218  value 100n  [C0201]  (hidden comment: C_0201)
C219  value 100n  [C0201]  (hidden comment: C_0201)
C220  value 100n  [C0201]  (hidden comment: C_0201)
C221  value 100n  [C0201]  (hidden comment: C_0201)
C222  4u7  [C0402]
C223  value 100n  [C0201]  (hidden comment: C_0201)
C224  4u7  [C0402]
C225  value 100n  [C0201]  (hidden comment: C_0201)
C226  value 100n  [C0201]  (hidden comment: C_0201)
C227  value 100n  [C0201]  (hidden comment: C_0201)
C228  value 100n  [C0201]  (hidden comment: C_0201)
C229  value 1u  [C0201]  (hidden comment: C_0201)
C230  value 1u  [C0201]  (hidden comment: C_0201)
C231  value 1u  [C0201]  (hidden comment: C_0201)
C232  value 1u  [C0201]  (hidden comment: C_0201)
C233  value 1u  [C0201]  (hidden comment: C_0201)
C234  value 1u  [C0201]  (hidden comment: C_0201)
C235  value 1u  [C0201]  (hidden comment: C_0201)
C236  value 1u  [C0201]  (hidden comment: C_0201)
C237  value 1u  [C0201]  (hidden comment: C_0201)
FB5  FB_0402  [FB0402]  (value not drawn)
FB6  FB_0402  [FB0402]  (value not drawn)
FB7  FB_0402  [FB0402]  (value not drawn)
FB8  FB_0402  [FB0402]  (value not drawn)
FB9  FB_0402  [FB0402]  (value not drawn)
FB10  FB_0402  [FB0402]  (value not drawn)
FB11  FB_0402  [FB0402]  (value not drawn)
FB12  FB_0402  [FB0402]  (value not drawn)
FB13  FB_0402  [FB0402]  (value not drawn)
J9  Conn_01x02_Pin  (value not drawn)
U18#1  AM6254ATCGHAALW  [AM6254ATCGHAALW]  (part A of 15)

### Nets
+1V2_PMIC: C215.1 C216.1 C217.1 C218.1 C219.1 C220.1 U18#1.K9(VDDS_DDR) U18#1.L8(VDDS_DDR) U18#1.M9(VDDS_DDR_C) U18#1.P9(VDDS_DDR) U18#1.R8(VDDS_DDR)
+1V8_LDO: C187.1 C188.1 C189.1 FB7.2 FB8.2 FB9.2 FB10.2 FB11.2 FB12.2 FB13.2 U18#1.G7(VDDS_OSC0) U18#1.G16(VDDA_TEMP1) U18#1.T9(VDDA_TEMP0)
+1V8_REG: C202.1 C203.1 C204.1 C205.1 C206.1 C207.1 C208.1 C209.1 C210.1 C211.1 C212.1 C213.1 C214.1 U18#1.F15(VDDSHV0) U18#1.G10(VMON_1P8_SOC) U18#1.G14(VDDSHV0) U18#1.G17(VDDSHV5) U18#1.L18(VDDSHV1) U18#1.M19(VDDSHV1) U18#1.N18(VDDSHV3) U18#1.P18(VDDSHV3) U18#1.T7(VDDSHV4) U18#1.T19(VDDSHV3) U18#1.U18(VDDSHV3) U18#1.W16(VDDSHV2) U18#1.W19(VDDSHV2)
+3V3_PMIC: C224.1 C225.1 C226.1 C227.1 C228.1 U18#1.F11(VDDSHV_MCU) U18#1.G12(VDDSHV_MCU) U18#1.H9(VDDSHV_CANUART) U18#1.K10(VMON_3P3_SOC) U18#1.Y13(VDDA_3P3_USB)
+5V_VBUS: U18#1.H10(VMON_VSYS)
+VDD_uSD: C222.1 C223.1 U18#1.J18(VDDSHV6)
GND: C145.2 C146.2 C147.2 C148.2 C149.2 C150.2 C151.2 C152.2 C153.2 C154.2 C155.2 C156.2 C157.2 C158.2 C159.2 C160.2 C161.2 C162.2 C163.2 C164.2 C165.2 C166.2 C167.2 C168.2 C169.2 C170.2 C171.2 C172.2 C173.2 C174.2 C175.2 C176.2 C177.2 C178.2 C179.2 C180.2 C181.2 C182.2 C183.2 C184.2 C185.2 C186.2 C187.2 C188.2 C189.2 C190.2 C191.2 C192.2 C193.2 C194.2 C195.2 C196.2 C197.2 C198.2 C199.2 C200.2 C201.2 C202.2 C203.2 C204.2 C205.2 C206.2 C207.2 C208.2 C209.2 C210.2 C211.2 C212.2 C213.2 C214.2 C215.2 C216.2 C217.2 C218.2 C219.2 C220.2 C221.2 C222.2 C223.2 C224.2 C225.2 C226.2 C227.2 C228.2 C229.2 C230.2 C231.2 C232.2 C233.2 C234.2 C235.2 C236.2 C237.2 J9.2(Pin_2) U18#1.A1(VSS) U18#1.A24(VSS) U18#1.A25(VSS) U18#1.AA11(VSS) U18#1.AB9(VSS) U18#1.AD1(VSS) U18#1.AD9(VSS) U18#1.AD12(VSS) U18#1.AD16(VSS) U18#1.AD25(VSS) U18#1.AE1(VSS) U18#1.AE8(VSS) U18#1.AE12(VSS) U18#1.AE16(VSS) U18#1.AE24(VSS) U18#1.AE25(VSS) U18#1.B25(VSS) U18#1.F13(VSS) U18#1.G13(VSS) U18#1.G19(VSS) U18#1.H13(VSS) U18#1.H16(VSS) U18#1.H18(VSS) U18#1.H20(VSS) U18#1.J7(VSS) U18#1.J13(VSS) U18#1.K7(VSS) U18#1.K13(VSS) U18#1.K15(VSS) U18#1.K19(VSS) U18#1.L20(VSS) U18#1.M7(VSS) U18#1.M8(VSS) U18#1.M10(VSS) U18#1.M12(VSS) U18#1.M13(VSS) U18#1.M17(VSS) U18#1.M18(VSS) U18#1.N15(VSS) U18#1.P7(VSS) U18#1.P10(VSS) U18#1.P13(VSS) U18#1.R13(VSS) U18#1.R15(VSS) U18#1.R18(VSS) U18#1.R20(VSS) U18#1.T8(VSS) U18#1.T13(VSS) U18#1.T14(VSS) U18#1.T16(VSS) U18#1.T17(VSS) U18#1.T18(VSS) U18#1.U8(VSS) U18#1.U19(VSS) U18#1.V9(VSS) U18#1.V10(VSS) U18#1.V11(VSS) U18#1.V13(VSS) U18#1.V16(VSS) U18#1.V18(VSS) U18#1.W7(VSS) U18#1.Y2(VSS)
VDD_CORE: C157.1 C158.1 C159.1 C160.1 C161.1 C162.1 C163.1 C164.1 C165.1 C166.1 C167.1 C168.1 C169.1 C170.1 C171.1 C172.1 C173.1 C174.1 C221.1 FB5.2 FB6.2 U18#1.F8(VDD_CANUART) U18#1.H8(VDD_CORE) U18#1.J11(VDD_CORE) U18#1.J14(VDD_CORE) U18#1.K17(VDD_CORE) U18#1.L12(VDD_CORE) U18#1.L15(VDD_CORE) U18#1.M16(VDD_CORE) U18#1.N8(VDD_CORE) U18#1.N11(VDD_CORE) U18#1.N13(VDD_CORE) U18#1.P17(VDD_CORE) U18#1.R11(VDD_CORE) U18#1.R14(VDD_CORE) U18#1.U12(VDD_CORE) U18#1.V8(VDD_CORE) U18#1.V15(VDD_CORE) U18#1.V17(VDD_CORE)
VDDR_CORE: C193.1 C194.1 C195.1 C196.1 C197.1 C198.1 C199.1 C200.1 C201.1 U18#1.J12(VDDR_CORE) U18#1.K16(VDDR_CORE) U18#1.N12(VDDR_CORE) U18#1.N14(VDDR_CORE) U18#1.P16(VDDR_CORE) U18#1.R12(VDDR_CORE) U18#1.T10(VDDR_CORE) U18#1.U14(VDDR_CORE)
CAP_VDDS0: C229.1 U18#1.H15(CAP_VDDS0)
CAP_VDDS1: C230.1 U18#1.K18(CAP_VDDS1)
CAP_VDDS2: C231.1 U18#1.W17(CAP_VDDS2)
CAP_VDDS3: C232.1 U18#1.P19(CAP_VDDS3)
CAP_VDDS4: C233.1 U18#1.U7(CAP_VDDS4)
CAP_VDDS5: C234.1 U18#1.H17(CAP_VDDS5)
CAP_VDDS6: C235.1 U18#1.J19(CAP_VDDS6)
CAP_VDDS_CANUART: C236.1 U18#1.G9(CAP_VDDS_CANUART)
CAP_VDDS_MCU: C237.1 U18#1.H11(CAP_VDDS_MCU)
SOC_VPP: J9.1(Pin_1) U18#1.J8(VPP)
VDDA_1P8_CSIRX0: C151.1 C152.1 C153.1 FB7.1 U18#1.W14(VDDA_1P8_CSIRX0)
VDDA_1P8_OLDI0: C175.1 C176.1 C177.1 FB9.1 U18#1.W9(VDDA_1P8_OLDI0) U18#1.W10(VDDA_1P8_OLDI0)
VDDA_1P8_USB: C154.1 C155.1 C156.1 FB8.1 U18#1.Y11(VDDA_1P8_USB)
VDDA_CORE_CSIRX0: C148.1 C149.1 C150.1 FB6.1 U18#1.W13(VDDA_CORE_CSIRX0)
VDDA_CORE_USB: C145.1 C146.1 C147.1 FB5.1 U18#1.W12(VDDA_CORE_USB)
VDDA_MCU: C178.1 C179.1 C180.1 FB10.1 U18#1.L11(VDDA_MCU)
VDDA_PLL0: C181.1 C182.1 C183.1 FB11.1 U18#1.U11(VDDA_PLL0)
VDDA_PLL1: C184.1 C185.1 C186.1 FB12.1 U18#1.U15(VDDA_PLL1)
VDDA_PLL2: C190.1 C191.1 C192.1 FB13.1 U18#1.L14(VDDA_PLL2)

### Layout directives
net class PWR: VDDA_1P8_CSIRX0, VDDA_1P8_OLDI0, VDDA_1P8_USB, VDDA_CORE_CSIRX0, VDDA_CORE_USB, VDDA_MCU, VDDA_PLL0, VDDA_PLL1, VDDA_PLL2

### Notes on the sheet
- (in symbol AM6254ATCGHAALW, part A) AM6254 - Power; x62
- (in symbol C_0201) 0201
- (in symbol C_0402) 0402

### Library data of the parts
C145 C146 C148 C149 C151 C152 C154 C155 C158-C176 C178 C179 C181 C182 C184 C185 C187-C191 C194-C201 C203-C214 C216-C221 C223 C225-C237 = C_0201: MLCC 0201; Manufacturer_Name: *; Manufacturer_Part_Number: *
C147 C150 C153 C156 C157 C177 C180 C183 C186 C192 C193 C202 C215 C222 C224 = C_0402: MLCC 0402; Manufacturer_Name: *; Manufacturer_Part_Number: *
  C147 C150 C153 C156 C177 C180 C183 C186 C192 C202 C222 C224: Value: 4u7
FB5-FB13 = FB_0402: Ferrite bead; Parameter 1: *
J9 = Conn_01x02_Pin: Generic connector, single row, 01x02, script generated
U18#1 = AM6254ATCGHAALW: TI AM6254, quad Cortex-A53 SoC, ALW 425-ball FCCSP 13x13mm 0.5mm pitch; separate interface and power units; Pinmux_Note: Each physical ball occurs once under its primary interface. See companion pinmux CSV for alternate functions. Multiplexable digital pads use bidirectional ERC type.; KiCad_Footprint: SamacSys_Parts:BGA425C50P25X25_1300X1300X89; MPN: AM6254ATCGHAALW; Footprint_Note: Unassigned: requires verified ALW0425 425-ball FCCSP, 13x13mm, 0.5mm pitch; do not substitute a fully populated BGA.; Datasheet: https://www.ti.com/lit/ds/symlink/am625.pdf; ComponentLink1Description: Datasheet; ComponentLink1URL: https://www.ti.com/lit/ds/symlink/am625.pdf

## Sheet 07_Clock.SchDoc
size A3; SheetNumber: 14; SheetTotal: 21
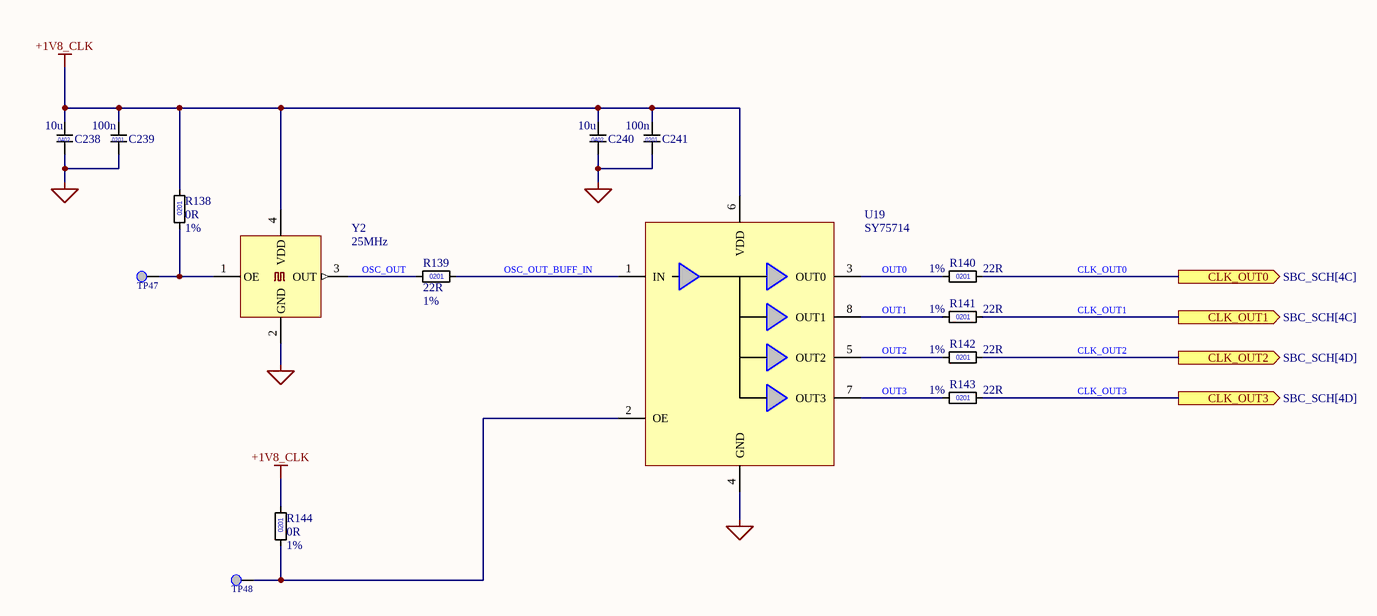
[diagram p13: 07_Clock.SchDoc]

### Parts
C238  value 10u  [C0402]  (hidden comment: 4u7)
C239  value 100n  [C0201]  (hidden comment: C_0201)
C240  value 10u  [C0402]  (hidden comment: 4u7)
C241  value 100n  [C0201]  (hidden comment: C_0201)
R138  value 0R  Tolerance: 1%  [R0201]  (hidden comment: 0201)
R139  value 22R  Tolerance: 1%  [R0201]  (hidden comment: 0201)
R140  value 22R  Tolerance: 1%  [R0201]  (hidden comment: 0201)
R141  value 22R  Tolerance: 1%  [R0201]  (hidden comment: 0201)
R142  value 22R  Tolerance: 1%  [R0201]  (hidden comment: 0201)
R143  value 22R  Tolerance: 1%  [R0201]  (hidden comment: 0201)
R144  value 0R  Tolerance: 1%  [R0201]  (hidden comment: 0201)
TP47  Testpoint 0.5mm  [TP_0.50mm]  (value not drawn)  (no BOM)
TP48  Testpoint 0.5mm  [TP_0.50mm]  (value not drawn)  (no BOM)
U19  SY75714  [TDFN-8-2x2mm_P0.5mm]
Y2  value 25MHz  [Oscillator_SMD_ECS_2520MV-xxx-xx-4Pin_2.5x2.0mm]  (hidden comment: ECS-2520MV)

### Ports
CLK_OUT0 (out, see SBC_SCH[4C]), CLK_OUT1 (out, see SBC_SCH[4C]), CLK_OUT2 (out, see SBC_SCH[4D]), CLK_OUT3 (out, see SBC_SCH[4D])

### Nets
+1V8_CLK: C238.1 C239.1 C240.1 C241.1 R138.R? R144.R? U19.6(VDD) Y2.4(VDD)
GND: C238.2 C239.2 C240.2 C241.2 U19.4(GND) Y2.2(GND)
CLK_OUT0: R140.R? ; port CLK_OUT0
CLK_OUT1: R141.R? ; port CLK_OUT1
CLK_OUT2: R142.R? ; port CLK_OUT2
CLK_OUT3: R143.R? ; port CLK_OUT3
OSC_OUT: R139.1 Y2.3(OUT)
OSC_OUT_BUFF_IN: R139.R? U19.1(IN)
OUT0: R140.1 U19.3(OUT0)
OUT1: R141.1 U19.8(OUT1)
OUT2: R142.1 U19.5(OUT2)
OUT3: R143.1 U19.7(OUT3)
NetR138_1: R138.1 TP47.TP Y2.1(OE)
NetR144_1: R144.1 TP48.TP U19.2(OE)

### Notes on the sheet
- (in symbol C_0201) 0201
- (in symbol C_0402) 0402

### Library data of the parts
C238 C240 = C_0402: MLCC 0402; Manufacturer_Name: *; Manufacturer_Part_Number: *
C239 C241 = C_0201: MLCC 0201; Manufacturer_Name: *; Manufacturer_Part_Number: *
R138-R144 = R_0201: Manufacturer_Name: *; Manufacturer_Part_Number: *
U19 = SY75714: Clock Clock Buffer IC 1:4 250 MHz 8-WFDFN Exposed Pad; Manufacturer_Name: *; Manufacturer_Part_Number: *; Value: SY75714
Y2 = ECS-2520MV: 25 MHz XO (Standard) HCMOS Oscillator 1.6V ~ 3.6V Enable/Disable 4-SMD, No Lead; Manufacturer_Part_Number: ECS-2520MV-250-CN-TR; Manufacturer_Name: ECS

## Sheet 02_SoC_DRAM_DDR4.SchDoc
size A3; SheetNumber: 15; SheetTotal: 21
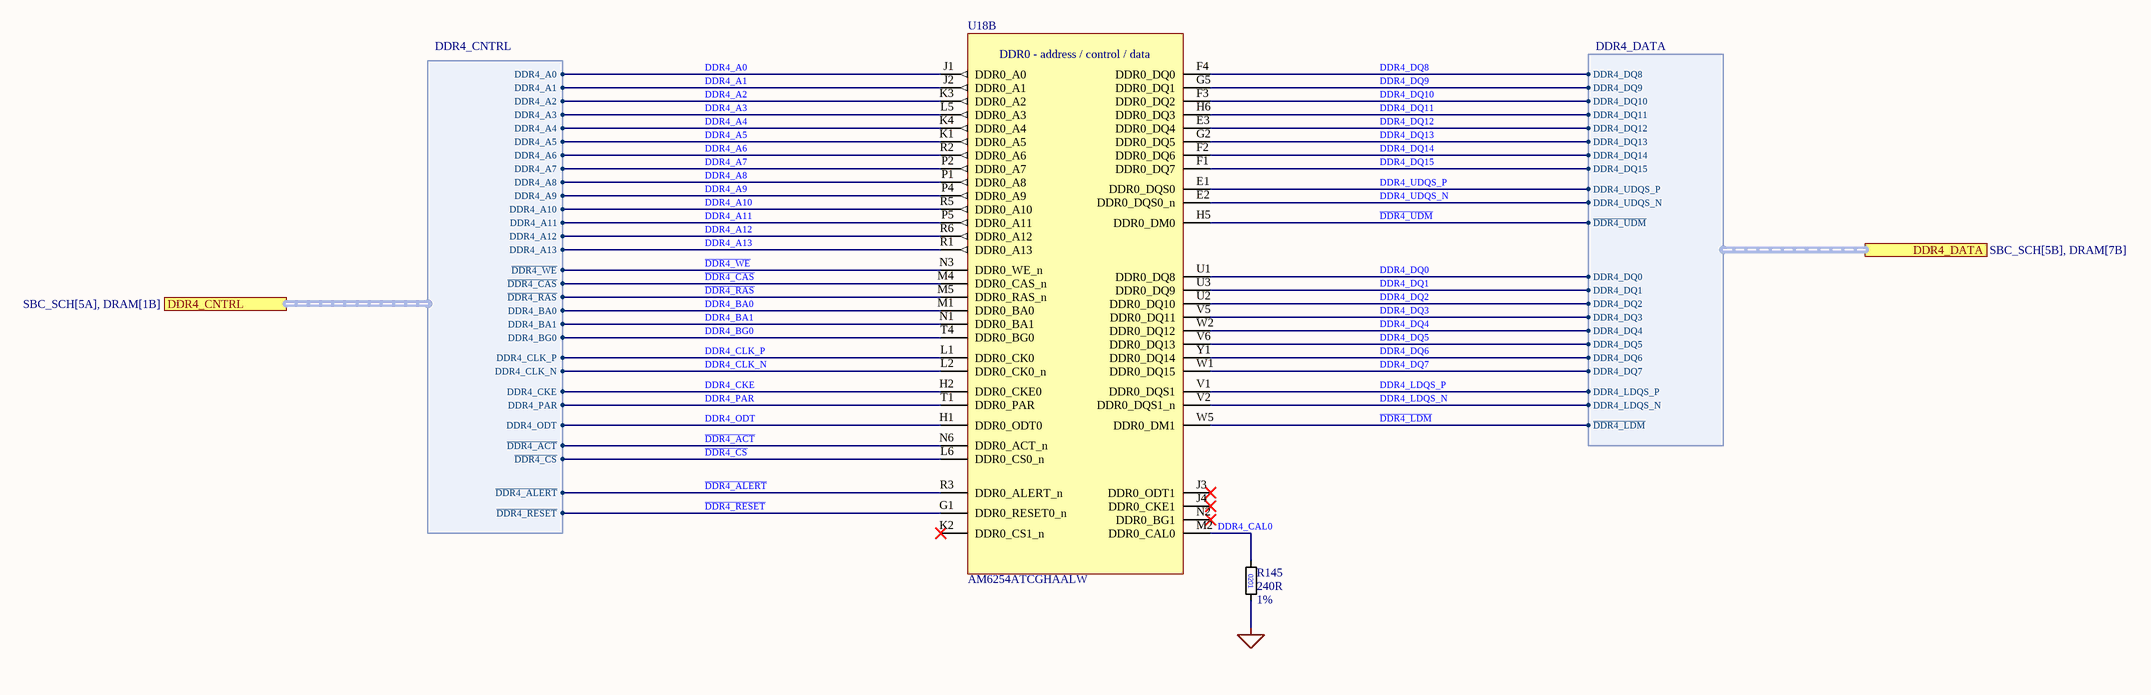
[diagram p14: 02_SoC_DRAM_DDR4.SchDoc]

### Parts
(Parts that share a designator on the sheet are numbered #1, #2 ... from top to bottom, then left to right.)
R145  value 240R  Tolerance: 1%  [R0201]  (hidden comment: 0201)
U18#1  AM6254ATCGHAALW  [AM6254ATCGHAALW]  (part B of 15)

### Ports
DDR4_CNTRL (harness DDR4_CNTRL, see SBC_SCH[5A], DRAM[1B]), DDR4_DATA (harness DDR4_DATA, see SBC_SCH[5B], DRAM[7B])

### Harnesses
DDR4_CNTRL: DDR4_A0, DDR4_A1, DDR4_A2, DDR4_A3, DDR4_A4, DDR4_A5, DDR4_A6, DDR4_A7, DDR4_A8, DDR4_A9, DDR4_A10, DDR4_A11, DDR4_A12, DDR4_A13, ~{DDR4_WE}, ~{DDR4_CAS}, ~{DDR4_RAS}, DDR4_BA0, DDR4_BA1, DDR4_BG0, DDR4_CLK_P, DDR4_CLK_N, DDR4_CKE, DDR4_PAR, DDR4_ODT, ~{DDR4_ACT}, ~{DDR4_CS}, ~{DDR4_ALERT}, ~{DDR4_RESET}
DDR4_DATA: DDR4_DQ8, DDR4_DQ9, DDR4_DQ10, DDR4_DQ11, DDR4_DQ12, DDR4_DQ13, DDR4_DQ14, DDR4_DQ15, DDR4_UDQS_P, DDR4_UDQS_N, ~{DDR4_UDM}, DDR4_DQ0, DDR4_DQ1, DDR4_DQ2, DDR4_DQ3, DDR4_DQ4, DDR4_DQ5, DDR4_DQ6, DDR4_DQ7, DDR4_LDQS_P, DDR4_LDQS_N, ~{DDR4_LDM}

### Nets
GND: R145.2
~{DDR4_ACT}: U18#1.N6(DDR0_ACT_n) ; port DDR4_CNTRL.~{DDR4_ACT}
~{DDR4_ALERT}: U18#1.R3(DDR0_ALERT_n) ; port DDR4_CNTRL.~{DDR4_ALERT}
~{DDR4_CAS}: U18#1.M4(DDR0_CAS_n) ; port DDR4_CNTRL.~{DDR4_CAS}
~{DDR4_CS}: U18#1.L6(DDR0_CS0_n) ; port DDR4_CNTRL.~{DDR4_CS}
~{DDR4_LDM}: U18#1.W5(DDR0_DM1) ; port DDR4_DATA.~{DDR4_LDM}
~{DDR4_RAS}: U18#1.M5(DDR0_RAS_n) ; port DDR4_CNTRL.~{DDR4_RAS}
~{DDR4_RESET}: U18#1.G1(DDR0_RESET0_n) ; port DDR4_CNTRL.~{DDR4_RESET}
~{DDR4_UDM}: U18#1.H5(DDR0_DM0) ; port DDR4_DATA.~{DDR4_UDM}
~{DDR4_WE}: U18#1.N3(DDR0_WE_n) ; port DDR4_CNTRL.~{DDR4_WE}
DDR4_A0: U18#1.J1(DDR0_A0) ; port DDR4_CNTRL.DDR4_A0
DDR4_A1: U18#1.J2(DDR0_A1) ; port DDR4_CNTRL.DDR4_A1
DDR4_A2: U18#1.K3(DDR0_A2) ; port DDR4_CNTRL.DDR4_A2
DDR4_A3: U18#1.L5(DDR0_A3) ; port DDR4_CNTRL.DDR4_A3
DDR4_A4: U18#1.K4(DDR0_A4) ; port DDR4_CNTRL.DDR4_A4
DDR4_A5: U18#1.K1(DDR0_A5) ; port DDR4_CNTRL.DDR4_A5
DDR4_A6: U18#1.R2(DDR0_A6) ; port DDR4_CNTRL.DDR4_A6
DDR4_A7: U18#1.P2(DDR0_A7) ; port DDR4_CNTRL.DDR4_A7
DDR4_A8: U18#1.P1(DDR0_A8) ; port DDR4_CNTRL.DDR4_A8
DDR4_A9: U18#1.P4(DDR0_A9) ; port DDR4_CNTRL.DDR4_A9
DDR4_A10: U18#1.R5(DDR0_A10) ; port DDR4_CNTRL.DDR4_A10
DDR4_A11: U18#1.P5(DDR0_A11) ; port DDR4_CNTRL.DDR4_A11
DDR4_A12: U18#1.R6(DDR0_A12) ; port DDR4_CNTRL.DDR4_A12
DDR4_A13: U18#1.R1(DDR0_A13) ; port DDR4_CNTRL.DDR4_A13
DDR4_BA0: U18#1.M1(DDR0_BA0) ; port DDR4_CNTRL.DDR4_BA0
DDR4_BA1: U18#1.N1(DDR0_BA1) ; port DDR4_CNTRL.DDR4_BA1
DDR4_BG0: U18#1.T4(DDR0_BG0) ; port DDR4_CNTRL.DDR4_BG0
DDR4_CAL0: R145.1 U18#1.M2(DDR0_CAL0)
DDR4_CKE: U18#1.H2(DDR0_CKE0) ; port DDR4_CNTRL.DDR4_CKE
DDR4_CLK_N: U18#1.L2(DDR0_CK0_n) ; port DDR4_CNTRL.DDR4_CLK_N
DDR4_CLK_P: U18#1.L1(DDR0_CK0) ; port DDR4_CNTRL.DDR4_CLK_P
DDR4_DQ0: U18#1.U1(DDR0_DQ8) ; port DDR4_DATA.DDR4_DQ0
DDR4_DQ1: U18#1.U3(DDR0_DQ9) ; port DDR4_DATA.DDR4_DQ1
DDR4_DQ2: U18#1.U2(DDR0_DQ10) ; port DDR4_DATA.DDR4_DQ2
DDR4_DQ3: U18#1.V5(DDR0_DQ11) ; port DDR4_DATA.DDR4_DQ3
DDR4_DQ4: U18#1.W2(DDR0_DQ12) ; port DDR4_DATA.DDR4_DQ4
DDR4_DQ5: U18#1.V6(DDR0_DQ13) ; port DDR4_DATA.DDR4_DQ5
DDR4_DQ6: U18#1.Y1(DDR0_DQ14) ; port DDR4_DATA.DDR4_DQ6
DDR4_DQ7: U18#1.W1(DDR0_DQ15) ; port DDR4_DATA.DDR4_DQ7
DDR4_DQ8: U18#1.F4(DDR0_DQ0) ; port DDR4_DATA.DDR4_DQ8
DDR4_DQ9: U18#1.G5(DDR0_DQ1) ; port DDR4_DATA.DDR4_DQ9
DDR4_DQ10: U18#1.F3(DDR0_DQ2) ; port DDR4_DATA.DDR4_DQ10
DDR4_DQ11: U18#1.H6(DDR0_DQ3) ; port DDR4_DATA.DDR4_DQ11
DDR4_DQ12: U18#1.E3(DDR0_DQ4) ; port DDR4_DATA.DDR4_DQ12
DDR4_DQ13: U18#1.G2(DDR0_DQ5) ; port DDR4_DATA.DDR4_DQ13
DDR4_DQ14: U18#1.F2(DDR0_DQ6) ; port DDR4_DATA.DDR4_DQ14
DDR4_DQ15: U18#1.F1(DDR0_DQ7) ; port DDR4_DATA.DDR4_DQ15
DDR4_LDQS_N: U18#1.V2(DDR0_DQS1_n) ; port DDR4_DATA.DDR4_LDQS_N
DDR4_LDQS_P: U18#1.V1(DDR0_DQS1) ; port DDR4_DATA.DDR4_LDQS_P
DDR4_ODT: U18#1.H1(DDR0_ODT0) ; port DDR4_CNTRL.DDR4_ODT
DDR4_PAR: U18#1.T1(DDR0_PAR) ; port DDR4_CNTRL.DDR4_PAR
DDR4_UDQS_N: U18#1.E2(DDR0_DQS0_n) ; port DDR4_DATA.DDR4_UDQS_N
DDR4_UDQS_P: U18#1.E1(DDR0_DQS0) ; port DDR4_DATA.DDR4_UDQS_P

Not connected (* = marked no-connect by the designer): U18#1 J3(DDR0_ODT1)* J4(DDR0_CKE1)* K2(DDR0_CS1_n)* N2(DDR0_BG1)*

### Notes on the sheet
- (in symbol AM6254ATCGHAALW, part B) DDR0 - address / control / data

### Library data of the parts
R145 = R_0201: Manufacturer_Name: *; Manufacturer_Part_Number: *
U18#1 = AM6254ATCGHAALW: as U18#1 on sheet 03_SoC_Power; MPN: AM6254ATCGHAALW; Footprint_Note: Unassigned: requires verified ALW0425 425-ball FCCSP, 13x13mm, 0.5mm pitch; do not substitute a fully populated BGA.; Datasheet: https://www.ti.com/lit/ds/symlink/am625.pdf; ComponentLink1Description: Datasheet; ComponentLink1URL: https://www.ti.com/lit/ds/symlink/am625.pdf